# Altium project ultrazed_base.PrjPcb (part 1 of 2)
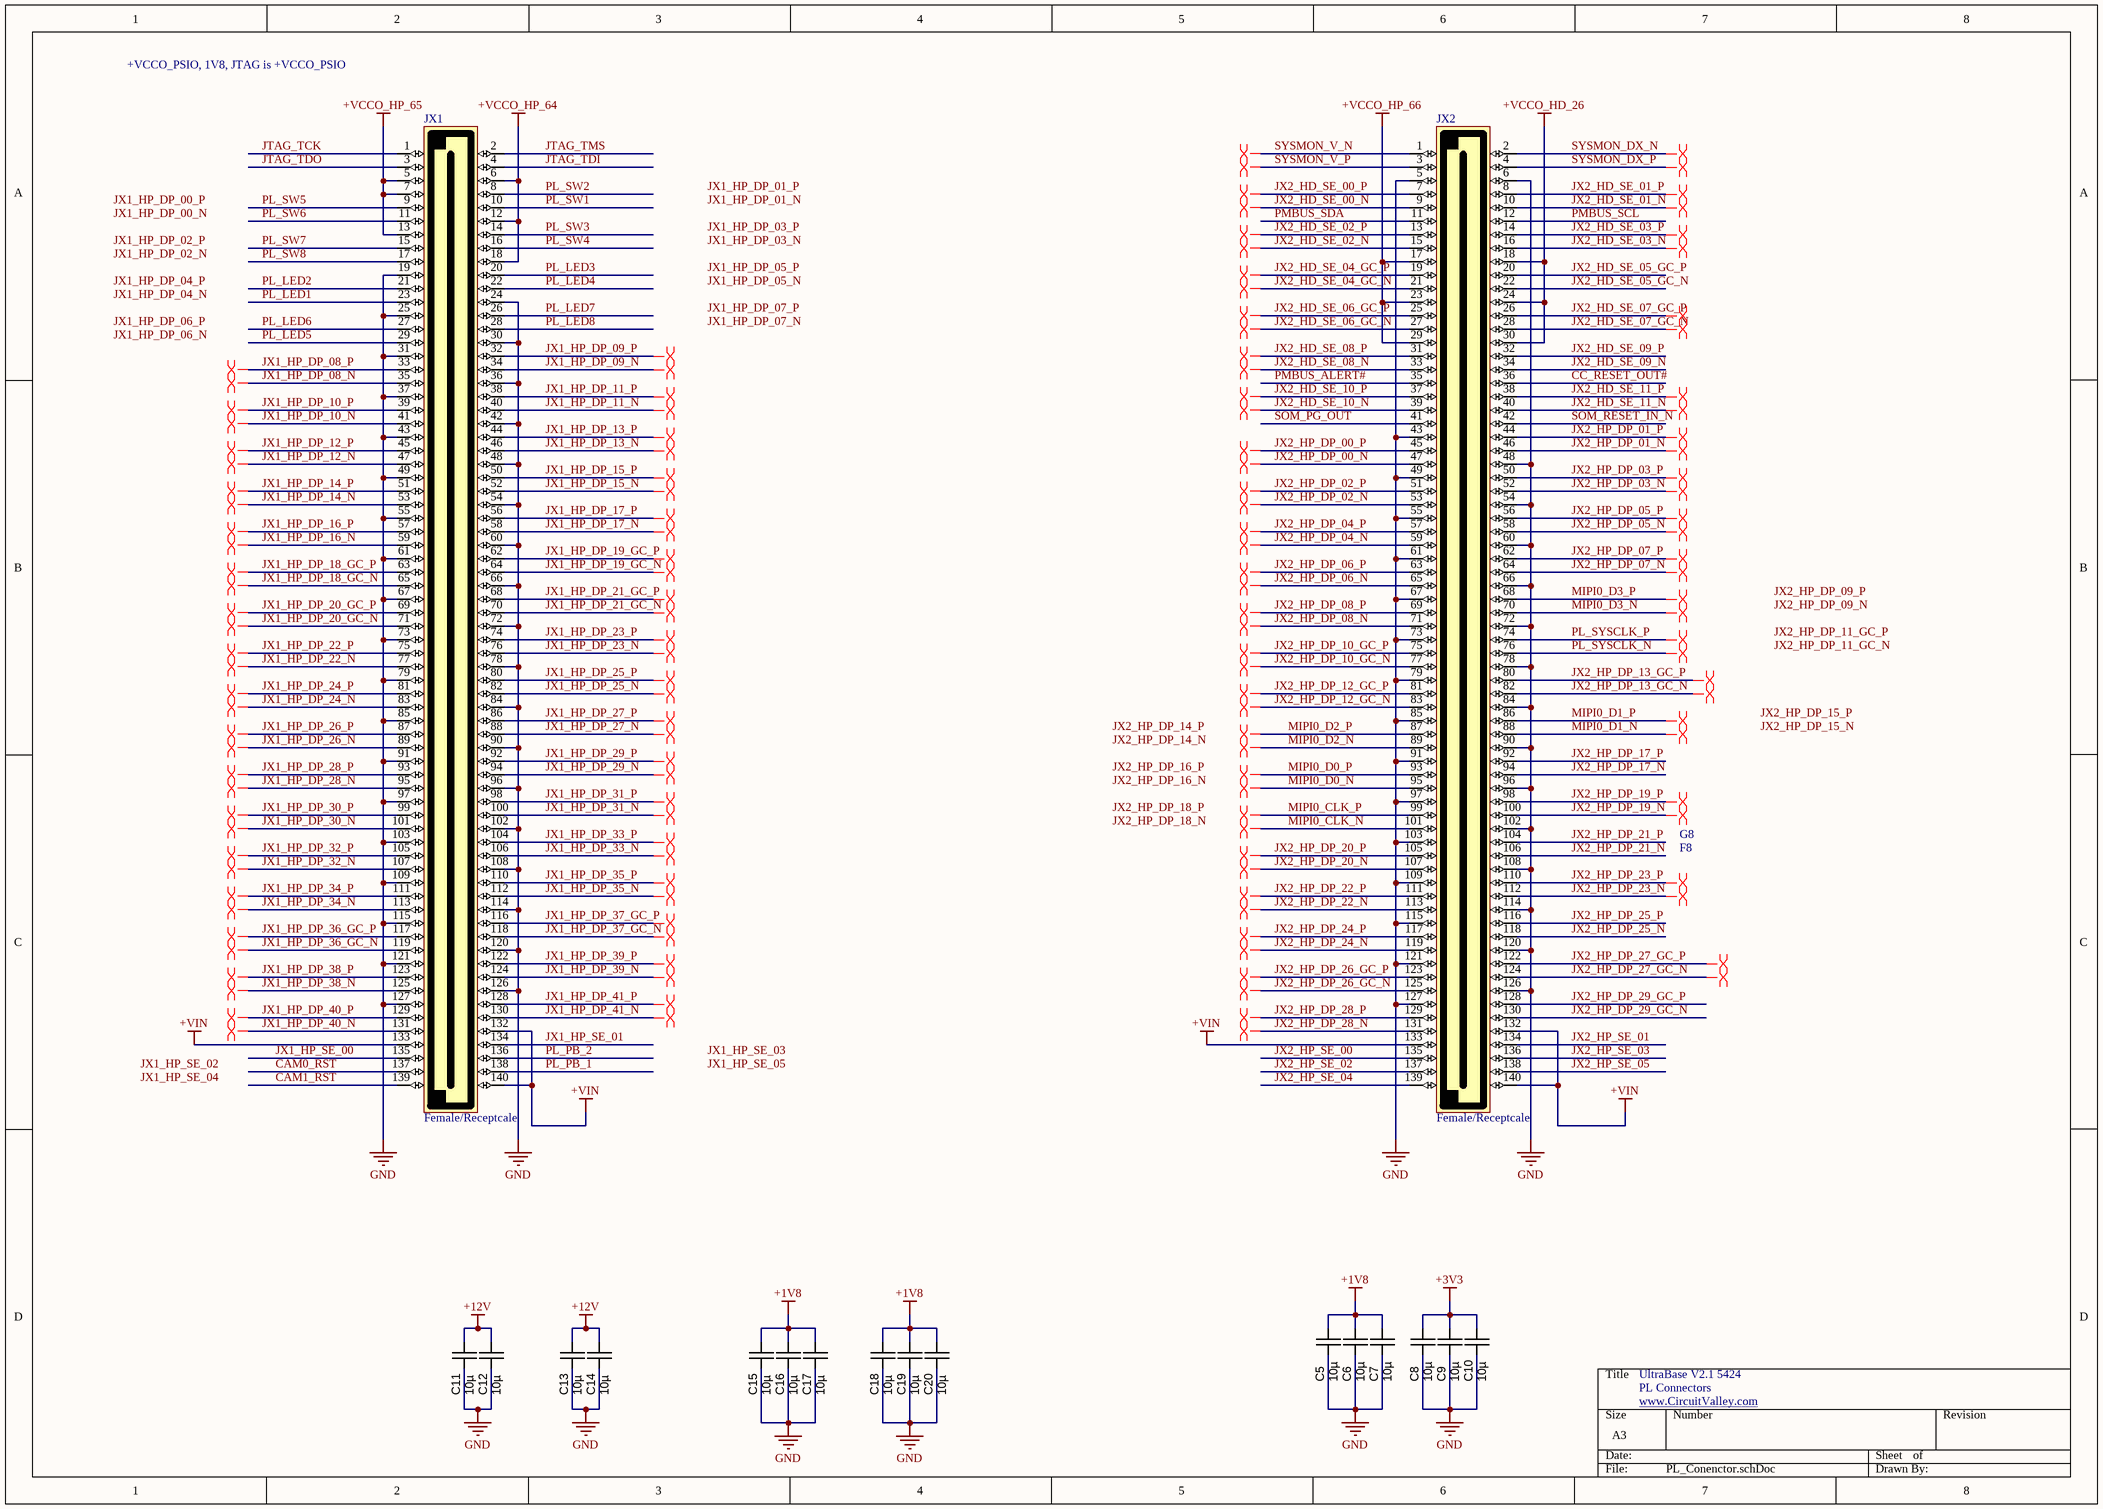
[diagram p0: PL_Conenctor.schDoc]
13 sheets, 354 parts. Net scope: global (net labels, ports and power ports of the same name join across sheets).
Board file: ultrazed_PCIe_x1.PcbDoc
Sheets:
  PL_Conenctor.schDoc
  PCIe.SchDoc
  SOM_JX_MIO.SchDoc
  MIO_SD.SchDoc
  POWER.SchDoc
  Ethernet.SchDoc
  DisplayPort.SchDoc
  Clock.SchDoc
  Switches_Leds.SchDoc
  PWR_INP.SchDoc
  IO.SchDoc
  JTAG.SchDoc
  MIPI.SchDoc

## Sheet PL_Conenctor.schDoc
size A3; SheetNumber: 1; SheetTotal: 13

### Parts
C5  10µ  [CAPC3225N]
C6  10µ  [CAPC3225N]
C7  10µ  [CAPC3225N]
C8  10µ  [CAPC3225N]
C9  10µ  [CAPC3225N]
C10  10µ  [CAPC3225N]
C11  10µ  [CAPC3225N]
C12  10µ  [CAPC3225N]
C13  10µ  [CAPC3225N]
C14  10µ  [CAPC3225N]
C15  10µ  [CAPC3225N]
C16  10µ  [CAPC3225N]
C17  10µ  [CAPC3225N]
C18  10µ  [CAPC3225N]
C19  10µ  [CAPC3225N]
C20  10µ  [CAPC3225N]
JX1  Female/Receptcale  [5177985-6]
JX2  Female/Receptcale  [5177985-6]

### Nets
+1V8: C5.1 C6.1 C7.1 C15.1 C16.1 C17.1 C18.1 C19.1 C20.1
+3V3: C8.1 C9.1 C10.1
+12V: C11.1 C12.1 C13.1 C14.1
+VCCO_HD_26: JX2.18 JX2.24 JX2.30
+VCCO_HP_64: JX1.6 JX1.12 JX1.18
+VCCO_HP_65: JX1.5 JX1.7 JX1.13
+VCCO_HP_66: JX2.17 JX2.23 JX2.29
+VIN: JX1.132 JX1.133 JX1.140 JX2.132 JX2.133 JX2.140
GND: C5.2 C6.2 C7.2 C8.2 C9.2 C10.2 C11.2 C12.2 C13.2 C14.2 C15.2 C16.2 C17.2 C18.2 C19.2 C20.2 JX1.19 JX1.24 JX1.25 JX1.30 JX1.31 JX1.36 JX1.37 JX1.42 JX1.43 JX1.48 JX1.49 JX1.54 JX1.55 JX1.60 JX1.61 JX1.66 JX1.67 JX1.72 JX1.73 JX1.78 JX1.79 JX1.84 JX1.85 JX1.90 JX1.91 JX1.96 JX1.97 JX1.102 JX1.103 JX1.108 JX1.109 JX1.114 JX1.115 JX1.120 JX1.121 JX1.126 JX1.127 JX2.5 JX2.6 JX2.43 JX2.48 JX2.49 JX2.54 JX2.55 JX2.60 JX2.61 JX2.66 JX2.67 JX2.72 JX2.73 JX2.78 JX2.79 JX2.84 JX2.85 JX2.90 JX2.91 JX2.96 JX2.97 JX2.102 JX2.103 JX2.108 JX2.109 JX2.114 JX2.115 JX2.120 JX2.121 JX2.126 JX2.127
CAM0_RST: JX1.137
CAM1_RST: JX1.139
CC_RESET_OUT#: JX2.36
JTAG_TCK: JX1.1
JTAG_TDI: JX1.4
JTAG_TDO: JX1.3
JTAG_TMS: JX1.2
JX1_HP_DP_08_N: JX1.35
JX1_HP_DP_08_P: JX1.33
JX1_HP_DP_09_N: JX1.34
JX1_HP_DP_09_P: JX1.32
JX1_HP_DP_10_N: JX1.41
JX1_HP_DP_10_P: JX1.39
JX1_HP_DP_11_N: JX1.40
JX1_HP_DP_11_P: JX1.38
JX1_HP_DP_12_N: JX1.47
JX1_HP_DP_12_P: JX1.45
JX1_HP_DP_13_N: JX1.46
JX1_HP_DP_13_P: JX1.44
JX1_HP_DP_14_N: JX1.53
JX1_HP_DP_14_P: JX1.51
JX1_HP_DP_15_N: JX1.52
JX1_HP_DP_15_P: JX1.50
JX1_HP_DP_16_N: JX1.59
JX1_HP_DP_16_P: JX1.57
JX1_HP_DP_17_N: JX1.58
JX1_HP_DP_17_P: JX1.56
JX1_HP_DP_18_GC_N: JX1.65
JX1_HP_DP_18_GC_P: JX1.63
JX1_HP_DP_19_GC_N: JX1.64
JX1_HP_DP_19_GC_P: JX1.62
JX1_HP_DP_20_GC_N: JX1.71
JX1_HP_DP_20_GC_P: JX1.69
JX1_HP_DP_21_GC_N: JX1.70
JX1_HP_DP_21_GC_P: JX1.68
JX1_HP_DP_22_N: JX1.77
JX1_HP_DP_22_P: JX1.75
JX1_HP_DP_23_N: JX1.76
JX1_HP_DP_23_P: JX1.74
JX1_HP_DP_24_N: JX1.83
JX1_HP_DP_24_P: JX1.81
JX1_HP_DP_25_N: JX1.82
JX1_HP_DP_25_P: JX1.80
JX1_HP_DP_26_N: JX1.89
JX1_HP_DP_26_P: JX1.87
JX1_HP_DP_27_N: JX1.88
JX1_HP_DP_27_P: JX1.86
JX1_HP_DP_28_N: JX1.95
JX1_HP_DP_28_P: JX1.93
JX1_HP_DP_29_N: JX1.94
JX1_HP_DP_29_P: JX1.92
JX1_HP_DP_30_N: JX1.101
JX1_HP_DP_30_P: JX1.99
JX1_HP_DP_31_N: JX1.100
JX1_HP_DP_31_P: JX1.98
JX1_HP_DP_32_N: JX1.107
JX1_HP_DP_32_P: JX1.105
JX1_HP_DP_33_N: JX1.106
JX1_HP_DP_33_P: JX1.104
JX1_HP_DP_34_N: JX1.113
JX1_HP_DP_34_P: JX1.111
JX1_HP_DP_35_N: JX1.112
JX1_HP_DP_35_P: JX1.110
JX1_HP_DP_36_GC_N: JX1.119
JX1_HP_DP_36_GC_P: JX1.117
JX1_HP_DP_37_GC_N: JX1.118
JX1_HP_DP_37_GC_P: JX1.116
JX1_HP_DP_38_N: JX1.125
JX1_HP_DP_38_P: JX1.123
JX1_HP_DP_39_N: JX1.124
JX1_HP_DP_39_P: JX1.122
JX1_HP_DP_40_N: JX1.131
JX1_HP_DP_40_P: JX1.129
JX1_HP_DP_41_N: JX1.130
JX1_HP_DP_41_P: JX1.128
JX1_HP_SE_00: JX1.135
JX1_HP_SE_01: JX1.134
JX2_HD_SE_00_N: JX2.9
JX2_HD_SE_00_P: JX2.7
JX2_HD_SE_01_N: JX2.10
JX2_HD_SE_01_P: JX2.8
JX2_HD_SE_02_N: JX2.15
JX2_HD_SE_02_P: JX2.13
JX2_HD_SE_03_N: JX2.16
JX2_HD_SE_03_P: JX2.14
JX2_HD_SE_04_GC_N: JX2.21
JX2_HD_SE_04_GC_P: JX2.19
JX2_HD_SE_05_GC_N: JX2.22
JX2_HD_SE_05_GC_P: JX2.20
JX2_HD_SE_06_GC_N: JX2.27
JX2_HD_SE_06_GC_P: JX2.25
JX2_HD_SE_07_GC_N: JX2.28
JX2_HD_SE_07_GC_P: JX2.26
JX2_HD_SE_08_N: JX2.33
JX2_HD_SE_08_P: JX2.31
JX2_HD_SE_09_N: JX2.34
JX2_HD_SE_09_P: JX2.32
JX2_HD_SE_10_N: JX2.39
JX2_HD_SE_10_P: JX2.37
JX2_HD_SE_11_N: JX2.40
JX2_HD_SE_11_P: JX2.38
JX2_HP_DP_00_N: JX2.47
JX2_HP_DP_00_P: JX2.45
JX2_HP_DP_01_N: JX2.46
JX2_HP_DP_01_P: JX2.44
JX2_HP_DP_02_N: JX2.53
JX2_HP_DP_02_P: JX2.51
JX2_HP_DP_03_N: JX2.52
JX2_HP_DP_03_P: JX2.50
JX2_HP_DP_04_N: JX2.59
JX2_HP_DP_04_P: JX2.57
JX2_HP_DP_05_N: JX2.58
JX2_HP_DP_05_P: JX2.56
JX2_HP_DP_06_N: JX2.65
JX2_HP_DP_06_P: JX2.63
JX2_HP_DP_07_N: JX2.64
JX2_HP_DP_07_P: JX2.62
JX2_HP_DP_08_N: JX2.71
JX2_HP_DP_08_P: JX2.69
JX2_HP_DP_10_GC_N: JX2.77
JX2_HP_DP_10_GC_P: JX2.75
JX2_HP_DP_12_GC_N: JX2.83
JX2_HP_DP_12_GC_P: JX2.81
JX2_HP_DP_13_GC_N: JX2.82
JX2_HP_DP_13_GC_P: JX2.80
JX2_HP_DP_17_N: JX2.94
JX2_HP_DP_17_P: JX2.92
JX2_HP_DP_19_N: JX2.100
JX2_HP_DP_19_P: JX2.98
JX2_HP_DP_20_N: JX2.107
JX2_HP_DP_20_P: JX2.105
JX2_HP_DP_21_N: JX2.106
JX2_HP_DP_21_P: JX2.104
JX2_HP_DP_22_N: JX2.113
JX2_HP_DP_22_P: JX2.111
JX2_HP_DP_23_N: JX2.112
JX2_HP_DP_23_P: JX2.110
JX2_HP_DP_24_N: JX2.119
JX2_HP_DP_24_P: JX2.117
JX2_HP_DP_25_N: JX2.118
JX2_HP_DP_25_P: JX2.116
JX2_HP_DP_26_GC_N: JX2.125
JX2_HP_DP_26_GC_P: JX2.123
JX2_HP_DP_27_GC_N: JX2.124
JX2_HP_DP_27_GC_P: JX2.122
JX2_HP_DP_28_N: JX2.131
JX2_HP_DP_28_P: JX2.129
JX2_HP_DP_29_GC_N: JX2.130
JX2_HP_DP_29_GC_P: JX2.128
JX2_HP_SE_00: JX2.135
JX2_HP_SE_01: JX2.134
JX2_HP_SE_02: JX2.137
JX2_HP_SE_03: JX2.136
JX2_HP_SE_04: JX2.139
JX2_HP_SE_05: JX2.138
MIPI0_CLK_N: JX2.101
MIPI0_CLK_P: JX2.99
MIPI0_D0_N: JX2.95
MIPI0_D0_P: JX2.93
MIPI0_D1_N: JX2.88
MIPI0_D1_P: JX2.86
MIPI0_D2_N: JX2.89
MIPI0_D2_P: JX2.87
MIPI0_D3_N: JX2.70
MIPI0_D3_P: JX2.68
PL_LED1: JX1.23
PL_LED2: JX1.21
PL_LED3: JX1.20
PL_LED4: JX1.22
PL_LED5: JX1.29
PL_LED6: JX1.27
PL_LED7: JX1.26
PL_LED8: JX1.28
PL_PB_1: JX1.138
PL_PB_2: JX1.136
PL_SW1: JX1.10
PL_SW2: JX1.8
PL_SW3: JX1.14
PL_SW4: JX1.16
PL_SW5: JX1.9
PL_SW6: JX1.11
PL_SW7: JX1.15
PL_SW8: JX1.17
PL_SYSCLK_N: JX2.76
PL_SYSCLK_P: JX2.74
PMBUS_ALERT#: JX2.35
PMBUS_SCL: JX2.12
PMBUS_SDA: JX2.11
SOM_PG_OUT: JX2.41
SOM_RESET_IN_N: JX2.42
SYSMON_DX_N: JX2.2
SYSMON_DX_P: JX2.4
SYSMON_V_N: JX2.1
SYSMON_V_P: JX2.3

### Layout directives
differential pair: JX1_HP_DP_08_N, JX1_HP_DP_08_P, JX1_HP_DP_09_N, JX1_HP_DP_09_P, JX1_HP_DP_10_N, JX1_HP_DP_10_P, JX1_HP_DP_11_N, JX1_HP_DP_11_P, JX1_HP_DP_12_N, JX1_HP_DP_12_P, JX1_HP_DP_13_N, JX1_HP_DP_13_P, JX1_HP_DP_14_N, JX1_HP_DP_14_P, JX1_HP_DP_15_N, JX1_HP_DP_15_P, JX1_HP_DP_16_N, JX1_HP_DP_16_P, JX1_HP_DP_17_N, JX1_HP_DP_17_P, JX1_HP_DP_18_GC_N, JX1_HP_DP_18_GC_P, JX1_HP_DP_19_GC_N, JX1_HP_DP_19_GC_P, JX1_HP_DP_20_GC_N, JX1_HP_DP_20_GC_P, JX1_HP_DP_21_GC_N, JX1_HP_DP_21_GC_P, JX1_HP_DP_22_N, JX1_HP_DP_22_P, JX1_HP_DP_23_N, JX1_HP_DP_23_P, JX1_HP_DP_24_N, JX1_HP_DP_24_P, JX1_HP_DP_25_N, JX1_HP_DP_25_P, JX1_HP_DP_26_N, JX1_HP_DP_26_P, JX1_HP_DP_27_N, JX1_HP_DP_27_P, JX1_HP_DP_28_N, JX1_HP_DP_28_P, JX1_HP_DP_29_N, JX1_HP_DP_29_P, JX1_HP_DP_30_N, JX1_HP_DP_30_P, JX1_HP_DP_31_N, JX1_HP_DP_31_P, JX1_HP_DP_32_N, JX1_HP_DP_32_P, JX1_HP_DP_33_N, JX1_HP_DP_33_P, JX1_HP_DP_34_N, JX1_HP_DP_34_P, JX1_HP_DP_35_N, JX1_HP_DP_35_P, JX1_HP_DP_36_GC_N, JX1_HP_DP_36_GC_P, JX1_HP_DP_37_GC_N, JX1_HP_DP_37_GC_P, JX1_HP_DP_38_N, JX1_HP_DP_38_P, JX1_HP_DP_39_N, JX1_HP_DP_39_P, JX1_HP_DP_40_N, JX1_HP_DP_40_P, JX1_HP_DP_41_N, JX1_HP_DP_41_P, JX2_HD_SE_00_N, JX2_HD_SE_00_P, JX2_HD_SE_01_N, JX2_HD_SE_01_P, JX2_HD_SE_02_N, JX2_HD_SE_02_P, JX2_HD_SE_03_N, JX2_HD_SE_03_P, JX2_HD_SE_04_GC_N, JX2_HD_SE_04_GC_P, JX2_HD_SE_06_GC_N, JX2_HD_SE_06_GC_P, JX2_HD_SE_07_GC_N, JX2_HD_SE_07_GC_P, JX2_HD_SE_08_N, JX2_HD_SE_08_P, JX2_HD_SE_10_N, JX2_HD_SE_10_P, JX2_HD_SE_11_N, JX2_HD_SE_11_P, JX2_HP_DP_00_N, JX2_HP_DP_00_P, JX2_HP_DP_01_N, JX2_HP_DP_01_P, JX2_HP_DP_02_N, JX2_HP_DP_02_P, JX2_HP_DP_03_N, JX2_HP_DP_03_P, JX2_HP_DP_04_N, JX2_HP_DP_04_P, JX2_HP_DP_05_N, JX2_HP_DP_05_P, JX2_HP_DP_06_N, JX2_HP_DP_06_P, JX2_HP_DP_07_N, JX2_HP_DP_07_P, JX2_HP_DP_08_N, JX2_HP_DP_08_P, JX2_HP_DP_10_GC_N, JX2_HP_DP_10_GC_P, JX2_HP_DP_12_GC_N, JX2_HP_DP_12_GC_P, JX2_HP_DP_13_GC_N, JX2_HP_DP_13_GC_P, JX2_HP_DP_19_N, JX2_HP_DP_19_P, JX2_HP_DP_20_N, JX2_HP_DP_20_P, JX2_HP_DP_22_N, JX2_HP_DP_22_P, JX2_HP_DP_23_N, JX2_HP_DP_23_P, JX2_HP_DP_24_N, JX2_HP_DP_24_P, JX2_HP_DP_26_GC_N, JX2_HP_DP_26_GC_P, JX2_HP_DP_27_GC_N, JX2_HP_DP_27_GC_P, JX2_HP_DP_28_N, JX2_HP_DP_28_P, MIPI0_CLK_N, MIPI0_CLK_P, MIPI0_D0_N, MIPI0_D0_P, MIPI0_D1_N, MIPI0_D1_P, MIPI0_D2_N, MIPI0_D2_P, MIPI0_D3_N, MIPI0_D3_P, PL_SYSCLK_N, PL_SYSCLK_P, SYSMON_DX_N, SYSMON_DX_P, SYSMON_V_N, SYSMON_V_P

### Notes on the sheet
- +VCCO_PSIO, 1V8, JTAG is +VCCO_PSIO
- G8
- F8
- UltraBase V2.1 5424
- PL Connectors
- www.CircuitValley.com <http://www.CircuitValley.com>
- Labels drawn without touching a wire or pin: JX1_HP_DP_00_N, JX1_HP_DP_00_P, JX1_HP_DP_01_N, JX1_HP_DP_01_P, JX1_HP_DP_02_N, JX1_HP_DP_02_P, JX1_HP_DP_03_N, JX1_HP_DP_03_P, JX1_HP_DP_04_N, JX1_HP_DP_04_P, JX1_HP_DP_05_N, JX1_HP_DP_05_P, JX1_HP_DP_06_N, JX1_HP_DP_06_P, JX1_HP_DP_07_N, JX1_HP_DP_07_P, JX1_HP_SE_02, JX1_HP_SE_03, JX1_HP_SE_04, JX1_HP_SE_05, JX2_HP_DP_09_N, JX2_HP_DP_09_P, JX2_HP_DP_11_GC_N, JX2_HP_DP_11_GC_P, JX2_HP_DP_14_N, JX2_HP_DP_14_P, JX2_HP_DP_15_N, JX2_HP_DP_15_P, JX2_HP_DP_16_N, JX2_HP_DP_16_P, JX2_HP_DP_18_N, JX2_HP_DP_18_P

### Library data of the parts
C5-C20 = CAPC_10u_1210_50V: Capacitor SMD Cer 10uF 20% 16V X5R 1210; Manufacturer 1: Taiyo Yuden; Manufacturer Part Number 1: UMK325BJ106MM-T; Ratings: 50V; X5R; Material: ceramic; Package / Case: 1210 (3225 Metric); Tolerance: ±20%; Size / Dimension: 0.126" L x 0.098" W (3.20mm x 2.50mm); Supplier 1: Digi-Key; Supplier Part Number 1: 587-2225-1-ND; Value: 10µ
JX1 = 5177985-6_Ultrazed_JX1: 140 Pin Ultrascale  SOM Connector with ultrazed specific SOM net delay
JX2 = 5177985-6_Ultrazed_JX2: 140 Pin Ultrascale  SOM Connector with ultrazed specific SOM net delay

## Sheet PCIe.SchDoc
size A3; SheetNumber: 2; SheetTotal: 13
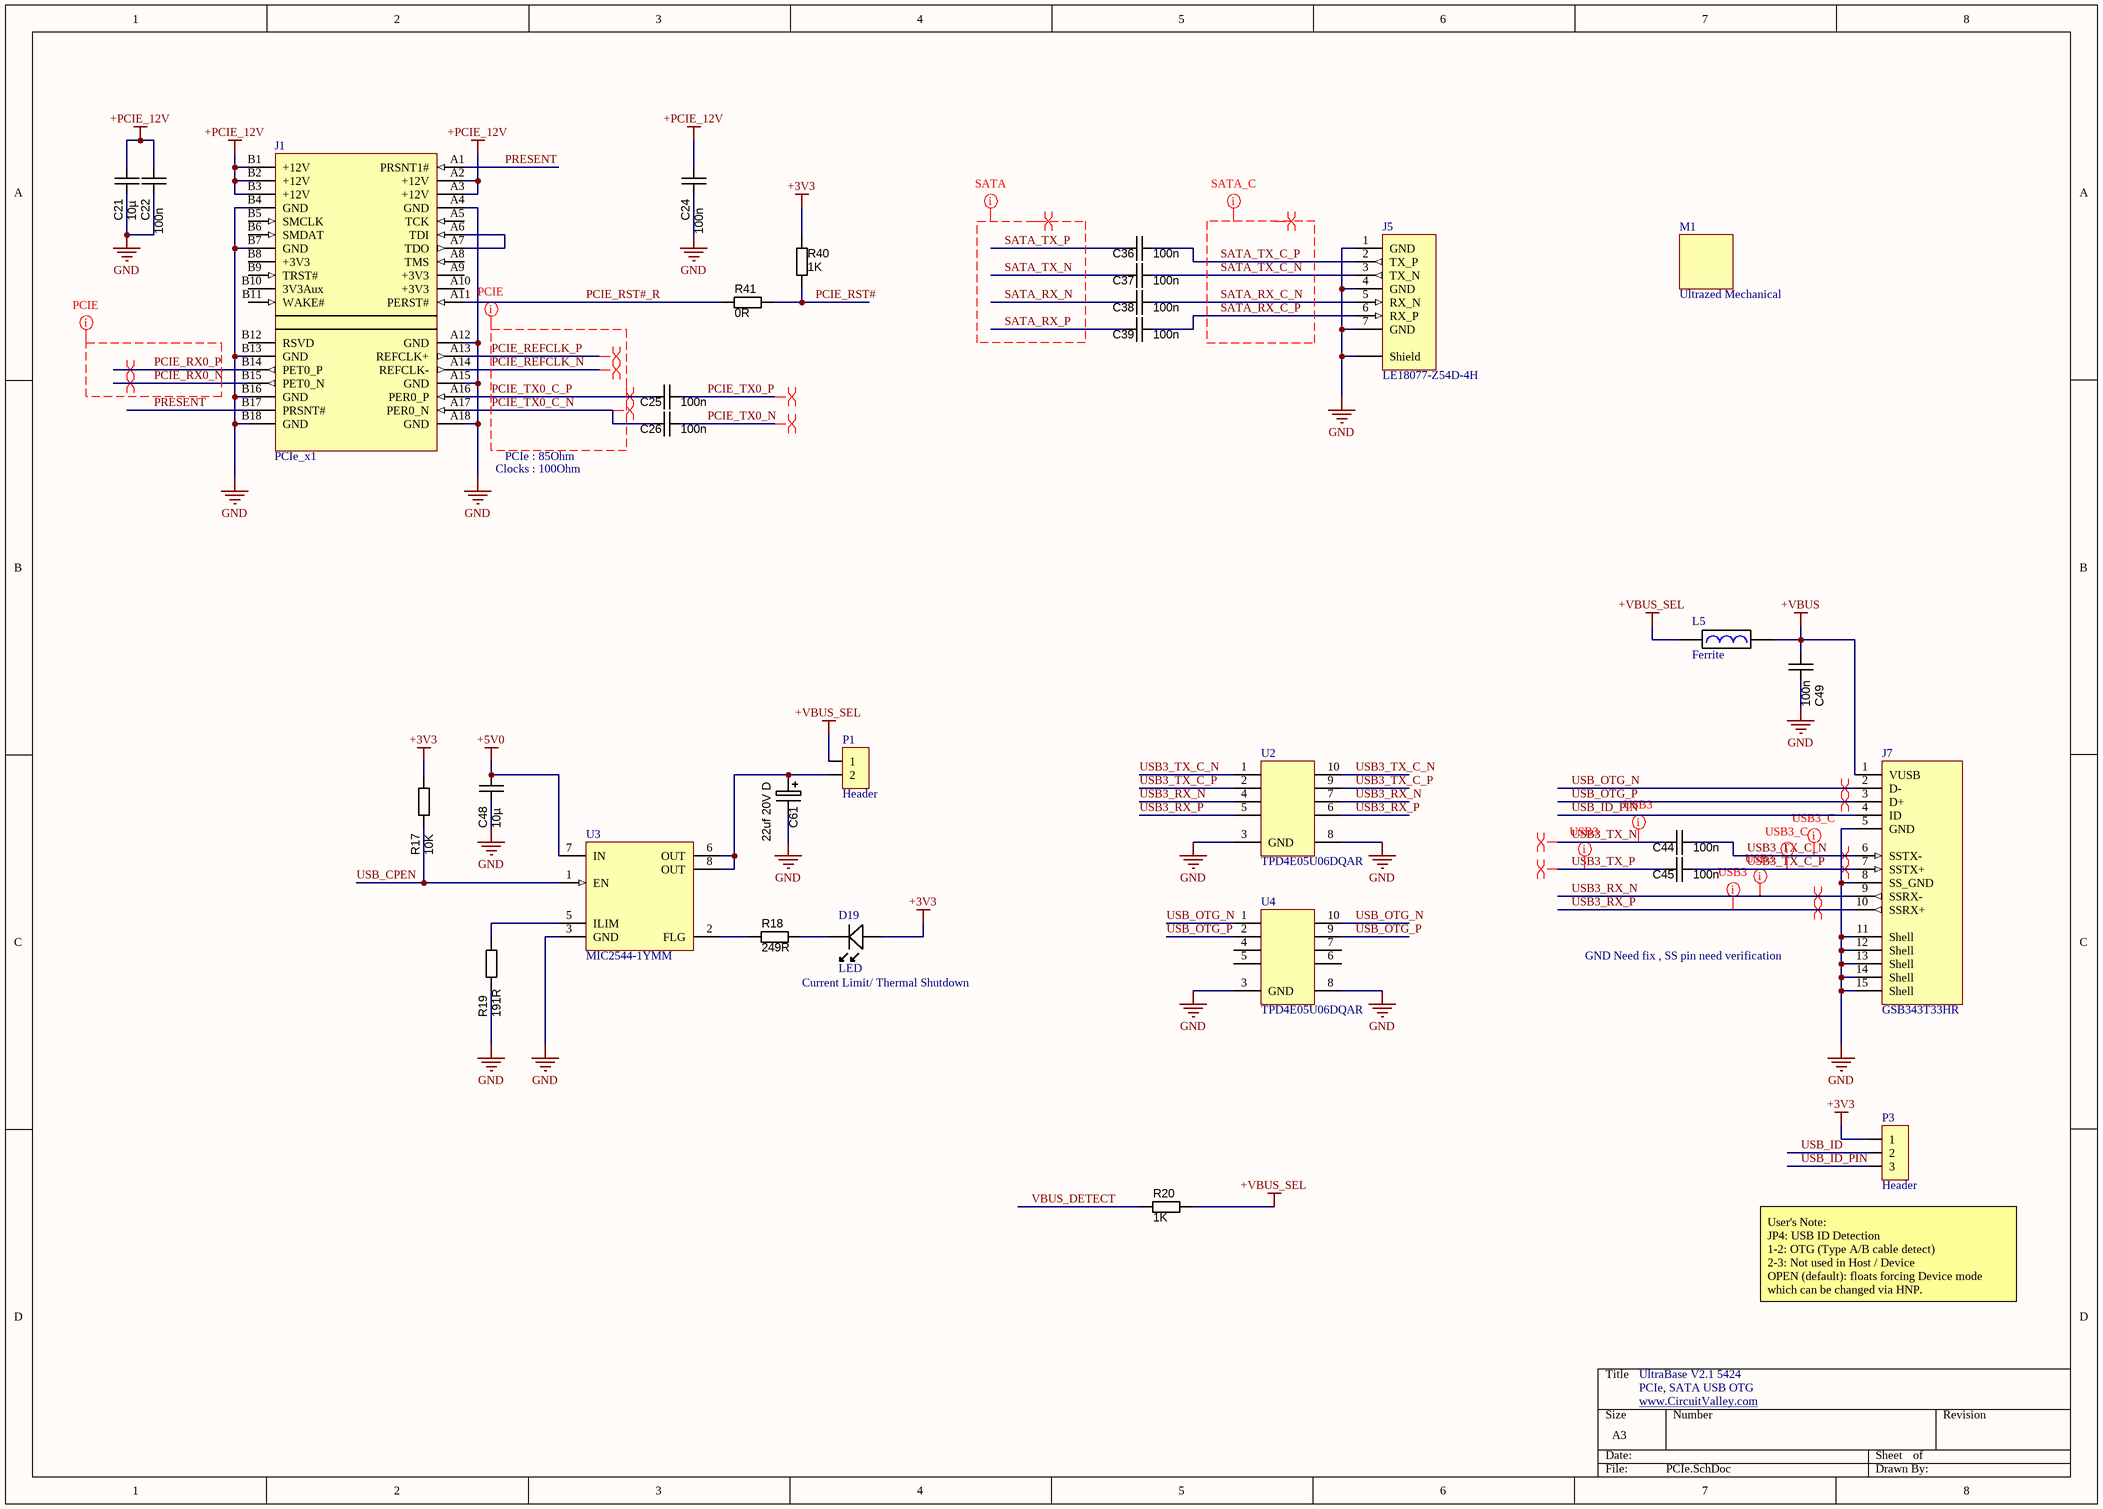
[diagram p1: PCIe.SchDoc]

### Parts
C21  10µ  [CAPC3225N]
C22  100n  [CAPC1608N]
C24  100n  [CAPC1608N]
C25  100n  [CAPC1005N]
C26  100n  [CAPC1005N]
C36  100n  [CAPC1005N]
C37  100n  [CAPC1005N]
C38  100n  [CAPC1005N]
C39  100n  [CAPC1005N]
C44  100n  [CAPC1005N]
C45  100n  [CAPC1005N]
C48  10µ  [CAPC3225N]
C49  100n  [CAPC1608N]
C61  value 22uf 20V D  [CAPMP7343X310N]  (hidden comment: 47uf 20V D)
D19  LED  [1206_LED]
J1  PCIe_x1  [PCIe_x1]
J5  LE18077-Z54D-4H  [LE18077-Z54D-4H]
J7  GSB343T33HR  [GSB343T33HR]
L5  Ferrite  [FBC2012N]
M1  Ultrazed Mechanical  [ULTRAZED_SOM_Mechanical]
P1  Header  [Header2x]
P3  Header  [Header3x]
R17  value 10K  [RESC1608N]  (hidden comment: RES_NL_0603)
R18  value 249R  [RESC1608N]  (hidden comment: RES_NL_0603)
R19  value 191R  [RESC1608N]  (hidden comment: RES_NL_0603)
R20  value 1K  [RESC1608N]  (hidden comment: RES_NL_0603)
R40  value 1K  [RESC1608N]  (hidden comment: RES_NL_0603)
R41  value 0R  [RESC1608N]  (hidden comment: RES_NL_0603)
U2  TPD4E05U06DQAR  [uDFN-10]
U3  MIC2544-1YMM  [MSOP8]
U4  TPD4E05U06DQAR  [uDFN-10]

### Nets
+3V3: D19.A P3.1 R17.1 R40.2
+5V0: C48.1 U3.7(IN)
+PCIE_12V: C21.1 C22.1 C24.1 J1.A2(+12V) J1.A3(+12V) J1.B1(+12V) J1.B2(+12V) J1.B3(+12V)
+VBUS: C49.1 J7.1(VUSB) L5.2
+VBUS_SEL: L5.1 P1.1 R20.2
GND: C21.2 C22.2 C24.2 C48.2 C49.2 C61.2 J1.A4(GND) J1.A12(GND) J1.A15(GND) J1.A18(GND) J1.B4(GND) J1.B7(GND) J1.B13(GND) J1.B16(GND) J1.B18(GND) J5.1(GND) J5.4(GND) J5.7(GND) J5.SH(Shield) J7.5(GND) J7.8(SS_GND) J7.11(Shell) J7.12(Shell) J7.13(Shell) J7.14(Shell) J7.15(Shell) R19.2 U2.3(GND) U2.8(GND) U3.3(GND) U4.3(GND) U4.8(GND)
PCIE_REFCLK_N: J1.A14(REFCLK-)
PCIE_REFCLK_P: J1.A13(REFCLK+)
PCIE_RST#: R40.1 R41.2
PCIE_RST#_R: J1.A11(PERST#) R41.1
PCIE_RX0_N: J1.B15(PET0_N)
PCIE_RX0_P: J1.B14(PET0_P)
PCIE_TX0_C_N: C26.1 J1.A17(PER0_N)
PCIE_TX0_C_P: C25.1 J1.A16(PER0_P)
PCIE_TX0_N: C26.2
PCIE_TX0_P: C25.2
PRESENT: J1.A1(PRSNT1#) J1.B17(PRSNT#)
SATA_RX_C_N: C38.2 J5.5(RX_N)
SATA_RX_C_P: C39.2 J5.6(RX_P)
SATA_RX_N: C38.1
SATA_RX_P: C39.1
SATA_TX_C_N: C37.2 J5.3(TX_N)
SATA_TX_C_P: C36.2 J5.2(TX_P)
SATA_TX_N: C37.1
SATA_TX_P: C36.1
USB3_RX_N: J7.9(SSRX-) U2.4 U2.7
USB3_RX_P: J7.10(SSRX+) U2.5 U2.6
USB3_TX_C_N: C44.2 J7.6(SSTX-) U2.1 U2.10
USB3_TX_C_P: C45.2 J7.7(SSTX+) U2.2 U2.9
USB3_TX_N: C44.1
USB3_TX_P: C45.1
USB_CPEN: R17.2 U3.1(EN)
USB_ID: P3.2
USB_ID_PIN: J7.4(ID) P3.3
USB_OTG_N: J7.2(D-) U4.1 U4.10
USB_OTG_P: J7.3(D+) U4.2 U4.9
VBUS_DETECT: R20.1
NetC61_1: C61.1 P1.2 U3.6(OUT) U3.8(OUT)
NetD19_K: D19.K R18.2
NetJ1_A6: J1.A6(TDI) J1.A7(TDO)
NetR18_1: R18.1 U3.2(FLG)
NetR19_1: R19.1 U3.5(ILIM)

Not connected (* = marked no-connect by the designer): J1 A5(TCK) A8(TMS) A9(+3V3) A10(+3V3) B5(SMCLK) B6(SMDAT) B8(+3V3) B9(TRST#) B10(3V3Aux) B11(WAKE#) B12(RSVD); U4 4 5 6 7

### Layout directives
differential pair: PCIE_REFCLK_N, PCIE_REFCLK_P, PCIE_RX0_N, PCIE_RX0_P, PCIE_TX0_C_N, PCIE_TX0_C_P, PCIE_TX0_N, PCIE_TX0_P, SATA_RX_C_N, SATA_RX_C_P, SATA_RX_N, SATA_RX_P, SATA_TX_C_N, SATA_TX_C_P, SATA_TX_N, SATA_TX_P, USB3_RX_N, USB3_RX_P, USB3_TX_C_N, USB3_TX_C_P, USB3_TX_N, USB3_TX_P, USB_OTG_N, USB_OTG_P
net class SATA: SATA_RX_N, SATA_RX_P, SATA_TX_N, SATA_TX_P
net class SATA_C: SATA_RX_C_N, SATA_RX_C_P, SATA_TX_C_N, SATA_TX_C_P
net class PCIE: PCIE_REFCLK_N, PCIE_REFCLK_P, PCIE_RX0_N, PCIE_RX0_P, PCIE_TX0_C_N, PCIE_TX0_C_P
net class USB3: USB3_RX_N, USB3_RX_P, USB3_TX_N, USB3_TX_P
net class USB3_C: USB3_TX_C_N, USB3_TX_C_P

### Notes on the sheet
- Clocks : 100Ohm
- PCIe : 85Ohm
- Current Limit/ Thermal Shutdown
- GND Need fix , SS pin need verification
- (near P3) User's Note:
  JP4: USB ID Detection
  1-2: OTG (Type A/B cable detect)
  2-3: Not used in Host / Device
  OPEN (default): floats forcing Device mode
  which can be changed via HNP.
- PCIe, SATA USB OTG
- UltraBase V2.1 5424
- www.CircuitValley.com <http://www.CircuitValley.com>

### Library data of the parts
C21 C48 = CAPC_10u_1210_50V: as C5 on sheet PL_Conenctor; Package / Case: 1210 (3225 Metric); Tolerance: ±20%; Size / Dimension: 0.126" L x 0.098" W (3.20mm x 2.50mm); Supplier 1: Digi-Key; Supplier Part Number 1: 587-2225-1-ND; Value: 10µ
C22 C24 C49 = CAPC_120p_0603_C0G_50V: Capacitor SMD Cer 120pF 10% 50V C0G 0603; Manufacturer 1: Kemet; Manufacturer Part Number 1: C0603C121K5GACTU; Ratings: 50V; C0G; Tolerance: ±10%; Operating Temperature: -55°C ~ 125°C; Package / Case: 0603 (1608 Metric); Supplier 1: Mouser; Supplier Part Number 1: 80-C0603C121K5G; Value: 100n
C25 C26 C36-C39 C44 C45 = CAPC_100n_0402_16V_10%: Capacitor SMD Cer 100nF 10% 16V X5R 0402; Manufacturer 1: AVX Corporation; Manufacturer Part Number 1: 0402YD104KAT2A; Ratings: 16V; X7R; Tolerance: ±10%; Operating Temperature: -55°C ~ 125°C; Package / Case: 0402 (1005 Metric); Size / Dimension: 0.039" L x 0.020" W (1.00mm x 0.50mm); Supplier 1: Digi-Key; Supplier Part Number 1: 478-1126-1-ND; ComponentLink1URL: http://www.avx.com/docs/Catalogs/cx5r.pdf; ComponentLink1Description: http://www.avx.com/docs/Catalogs/cx5r.pdf; Supplier 2: Digi-Key; Supplier Part Number 2: 311-1347-1-ND; Manufacturer 2: Yageo; Manufacturer Part Number 2: CC0402KRX5R7BB104; ComponentLink2URL: http://www.yageo.com/documents/recent/UPY-GPHC_X5R_4V-to-50V_12.pdf; ComponentLink2Description: http://www.yageo.com/documents/recent/UPY-GPHC_X5R_4V-to-50V_12.pdf; Value: 100n
C61 = CAPT_330u_2917_6V3: Capacitor SMD Tant 330uF 20% 6V3 2917; Manufacturer Part Number: T520D337M006ATE015; Part: TCJY226M025R0070; Ratings: 6.3V; Material: Solid Tantalum; ESR (Equivalent Series Resistance): 15 mOhm; Package / Case: 2917 (7343 Metric); Tolerance: ±20%; Operating Temperature: -55°C ~ 125°C; Size / Dimension: 0.287" L x 0.169" W (7.30mm x 4.30mm); Height - Seated (Max): 0.122" (3.10mm); Manufacturer Size Code: D; Supplier 1: Digi-Key; Supplier Part Number 1: 399-4052-1-ND; ComponentLink1URL: http://www.kemet.com/datasheets&T520D337M006ATE015; ComponentLink1Description: T520D Datasheet
J1 = PCIe_x1: PCIe X1 Card edge
J5 = SATA: Sata Connector Vertical
J7 = GSB343T33HR: USB3.2 Micro B
L5 = Ferrite Bead
M1 = UltrazedSOMMechanical
P1 = Header_2Pin: 2 Pin Header
P3 = Header_3Pin: 3 Pin Header
R17-R20 R40 R41 = RES_NL_0603: Resistor, SMD chip; Manufacturer 1: Royal Ohm; Ratings: 1/10 W; Tolerance: ±5%; Package / Case: 0603 (1608 metric)
U2 U4 = TPD4E05U06DQAR: ESD Protection
U3 = MIC2544: High Side Switch, Current limit programmable

## Sheet SOM_JX_MIO.SchDoc
size A3; SheetNumber: 3; SheetTotal: 13
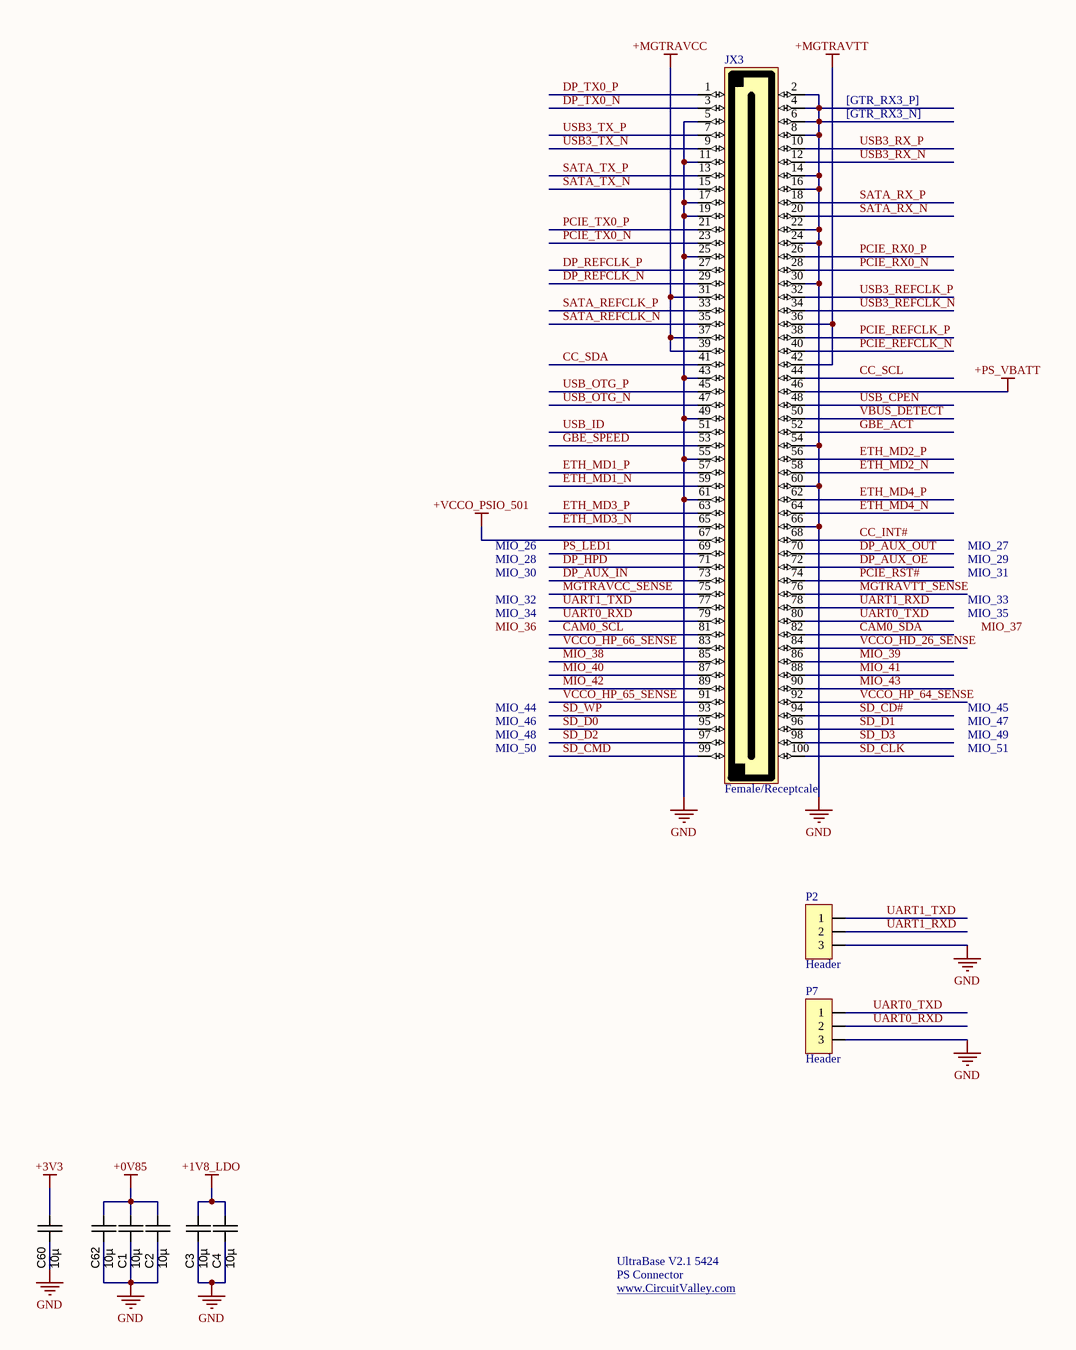
[diagram p2: SOM_JX_MIO.SchDoc]

### Parts
C1  10µ  [CAPC3225N]
C2  10µ  [CAPC3225N]
C3  10µ  [CAPC3225N]
C4  10µ  [CAPC3225N]
C60  10µ  [CAPC3225N]
C62  10µ  [CAPC3225N]
JX3  Female/Receptcale  [5177985-4]
P2  Header  [Header3x]
P7  Header  [Header3x]

### Nets
+0V85: C1.1 C2.1 C62.1
+1V8_LDO: C3.1 C4.1
+3V3: C60.1
+MGTRAVCC: JX3.31 JX3.37 JX3.39
+MGTRAVTT: JX3.36 JX3.42
+PS_VBATT: JX3.46
+VCCO_PSIO_501: JX3.67
GND: C1.2 C2.2 C3.2 C4.2 C60.2 C62.2 JX3.2 JX3.4 JX3.5 JX3.6 JX3.8 JX3.11 JX3.14 JX3.16 JX3.17 JX3.19 JX3.22 JX3.24 JX3.25 JX3.30 JX3.43 JX3.49 JX3.54 JX3.55 JX3.60 JX3.61 JX3.66 P2.3 P7.3
CAM0_SCL: JX3.81
CAM0_SDA: JX3.82
CC_INT#: JX3.68
CC_SCL: JX3.44
CC_SDA: JX3.41
DP_AUX_IN: JX3.73
DP_AUX_OE: JX3.72
DP_AUX_OUT: JX3.70
DP_HPD: JX3.71
DP_REFCLK_N: JX3.29
DP_REFCLK_P: JX3.27
DP_TX0_N: JX3.3
DP_TX0_P: JX3.1
ETH_MD1_N: JX3.59
ETH_MD1_P: JX3.57
ETH_MD2_N: JX3.58
ETH_MD2_P: JX3.56
ETH_MD3_N: JX3.65
ETH_MD3_P: JX3.63
ETH_MD4_N: JX3.64
ETH_MD4_P: JX3.62
GBE_ACT: JX3.52
GBE_SPEED: JX3.53
MGTRAVCC_SENSE: JX3.75
MGTRAVTT_SENSE: JX3.76
MIO_38: JX3.85
MIO_39: JX3.86
MIO_40: JX3.87
MIO_41: JX3.88
MIO_42: JX3.89
MIO_43: JX3.90
PCIE_REFCLK_N: JX3.40
PCIE_REFCLK_P: JX3.38
PCIE_RST#: JX3.74
PCIE_RX0_N: JX3.28
PCIE_RX0_P: JX3.26
PCIE_TX0_N: JX3.23
PCIE_TX0_P: JX3.21
PS_LED1: JX3.69
SATA_REFCLK_N: JX3.35
SATA_REFCLK_P: JX3.33
SATA_RX_N: JX3.20
SATA_RX_P: JX3.18
SATA_TX_N: JX3.15
SATA_TX_P: JX3.13
SD_CD#: JX3.94
SD_CLK: JX3.100
SD_CMD: JX3.99
SD_D0: JX3.95
SD_D1: JX3.96
SD_D2: JX3.97
SD_D3: JX3.98
SD_WP: JX3.93
UART0_RXD: JX3.79 P7.2
UART0_TXD: JX3.80 P7.1
UART1_RXD: JX3.78 P2.2
UART1_TXD: JX3.77 P2.1
USB3_REFCLK_N: JX3.34
USB3_REFCLK_P: JX3.32
USB3_RX_N: JX3.12
USB3_RX_P: JX3.10
USB3_TX_N: JX3.9
USB3_TX_P: JX3.7
USB_CPEN: JX3.48
USB_ID: JX3.51
USB_OTG_N: JX3.47
USB_OTG_P: JX3.45
VBUS_DETECT: JX3.50
VCCO_HD_26_SENSE: JX3.84
VCCO_HP_64_SENSE: JX3.92
VCCO_HP_65_SENSE: JX3.91
VCCO_HP_66_SENSE: JX3.83

### Notes on the sheet
- [GTR_RX3_P]
- [GTR_RX3_N]
- MIO_32
- MIO_26
- MIO_28
- MIO_30
- MIO_33
- MIO_31
- MIO_29
- MIO_27
- MIO_34
- MIO_35
- MIO_48
- MIO_46
- MIO_44
- MIO_45
- MIO_47
- MIO_49
- MIO_50
- MIO_51
- UltraBase V2.1 5424
- PS Connector
- www.CircuitValley.com <http://www.CircuitValley.com>
- Labels drawn without touching a wire or pin: MIO_36, MIO_37

### Library data of the parts
C1-C4 C60 C62 = CAPC_10u_1210_50V: as C5 on sheet PL_Conenctor; Package / Case: 1210 (3225 Metric); Tolerance: ±20%; Size / Dimension: 0.126" L x 0.098" W (3.20mm x 2.50mm); Supplier 1: Digi-Key; Supplier Part Number 1: 587-2225-1-ND; Value: 10µ
JX3 = 5177985-4_Ultrazed: 100 Pin Ultrascale  SOM Connector with ultrazed specific SOM net delay
P2 = Header_3Pin: 3 Pin Header; Value: NC
P7 = Header_3Pin: 3 Pin Header

## Sheet MIO_SD.SchDoc
size A3; SheetNumber: 4; SheetTotal: 13
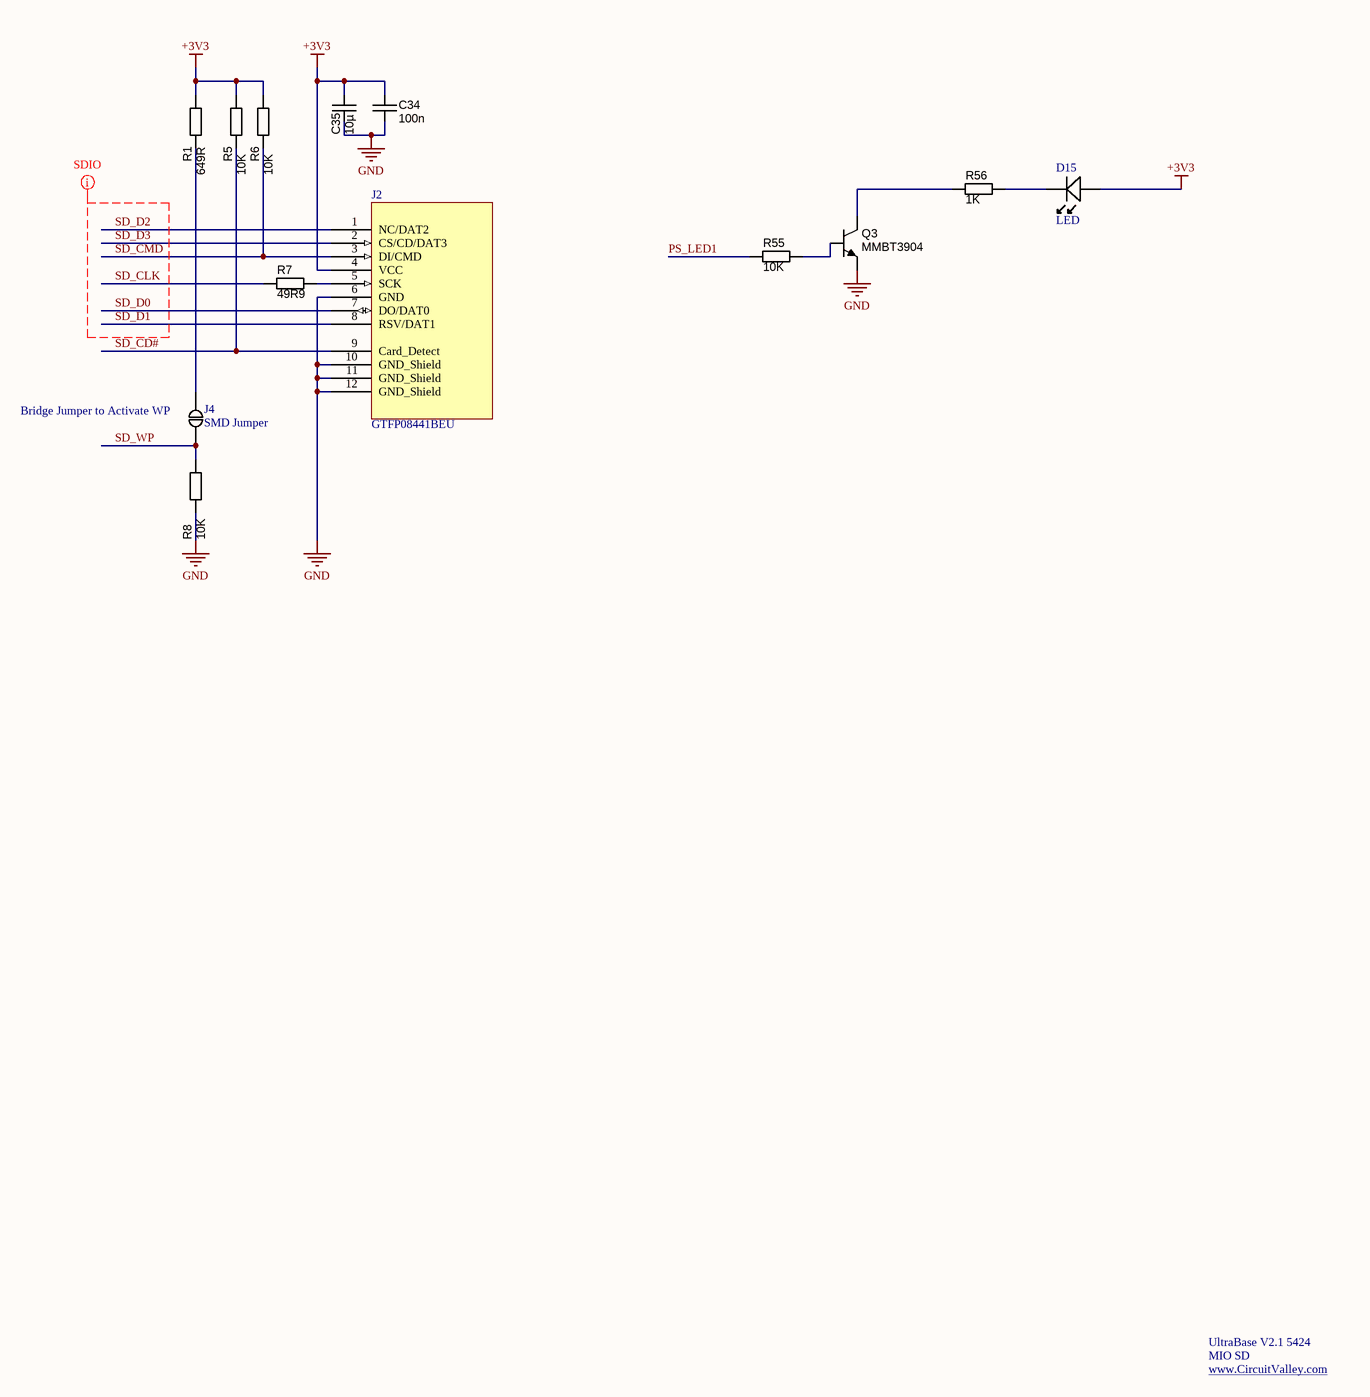
[diagram p3: MIO_SD.SchDoc]

### Parts
C34  100n  [CAPC1608N]
C35  10µ  [CAPC3225N]
D15  LED  [1206_LED]
J2  GTFP08441BEU  [GTFP08441BEU]
J4  SMD Jumper  [SMD_Jumper]  (net tie, no BOM)
Q3  Manufacturer Part Number 1: MMBT3904  [SOT23-3]  (hidden comment: NPN_MMBT3904)
R1  value 649R  [RESC1608N]  (hidden comment: RES_NL_0603)
R5  value 10K  [RESC1608N]  (hidden comment: RES_NL_0603)
R6  value 10K  [RESC1608N]  (hidden comment: RES_NL_0603)
R7  value 49R9  [RESC1608N]  (hidden comment: RES_NL_0603)
R8  value 10K  [RESC1608N]  (hidden comment: RES_NL_0603)
R55  value 10K  [RESC1608N]  (hidden comment: RES_NL_0603)
R56  value 1K  [RESC1608N]  (hidden comment: RES_NL_0603)

### Nets
+3V3: C34.1 C35.1 D15.A J2.4(VCC) R1.1 R5.1 R6.1
GND: C34.2 C35.2 J2.6(GND) J2.10(GND_Shield) J2.11(GND_Shield) J2.12(GND_Shield) Q3.2(E) R8.2
PS_LED1: R55.1
SD_CD#: J2.9(Card_Detect) R5.2
SD_CLK: R7.1
SD_CMD: J2.3(DI/CMD) R6.2
SD_D0: J2.7(DO/DAT0)
SD_D1: J2.8(RSV/DAT1)
SD_D2: J2.1(NC/DAT2)
SD_D3: J2.2(CS/CD/DAT3)
SD_WP: J4.1 R8.1
NetD15_K: D15.K R56.2
NetJ2_5: J2.5(SCK) R7.2
NetJ4_2: J4.2 R1.2
NetQ3_1: Q3.1(B) R55.2
NetQ3_3: Q3.3(C) R56.1

### Layout directives
net class SDIO: SD_CLK, SD_CMD, SD_D0, SD_D1, SD_D2, SD_D3

### Notes on the sheet
- (near J4) Bridge Jumper to Activate WP
- UltraBase V2.1 5424
- MIO SD
- www.CircuitValley.com <http://www.CircuitValley.com>

### Library data of the parts
C34 = CAPC_1n_0603_100V: Capacitor SMD Cer 1nF 10% 100V X7R 0603; Manufacturer 1: Murata Electronics North America; Manufacturer Part Number 1: GCM188R72A102KA37D; Ratings: 100V; X7R; Material: ceramic; Package / Case: 0603 (1608 metric); Tolerance: ±10%; Supplier 1: Digi-Key; Supplier Part Number 1: 490-4780-1-ND; Operating Temperature: -55°C ~ 125°C; Size / Dimension: 0.063" L x 0.031" W (1.60mm x 0.80mm); Thickness (Max): 0.035" (0.90mm); ComponentLink1URL: http://search.murata.co.jp/Ceramy/image/img/PDF/ENG/GCM188R72A102KA37.pdf; ComponentLink1Description: http://search.murata.co.jp/Ceramy/image/img/PDF/ENG/GCM188R72A102KA37.pdf; Value: 100n
C35 = CAPC_10u_1210_50V: as C5 on sheet PL_Conenctor; Package / Case: 1210 (3225 Metric); Tolerance: ±20%; Size / Dimension: 0.126" L x 0.098" W (3.20mm x 2.50mm); Supplier 1: Digi-Key; Supplier Part Number 1: 587-2225-1-ND; Value: 10µ
J2 = GTFP08441BEU: MicroSD card
J4 = SMD_Jumper
Q3 = NPN_MMBT3904: Transistor SMD NPN 40V 0.2A 350mW SOT-23; Manufacturer 1: Fairchild Semiconductor; Ratings: 40V; 200mA; 350mW; Material: Si; Package / Case: SOT-23; Supplier 1: Digi-Key; Supplier Part Number 1: MMBT3904FSCT-ND; Transistor Type: NPN; Mounting Type: Surface Mount
R1 R5-R8 R55 R56 = RES_NL_0603: as R17 on sheet PCIe; Package / Case: 0603 (1608 metric)

## Sheet POWER.SchDoc
size A3; SheetNumber: 5; SheetTotal: 13
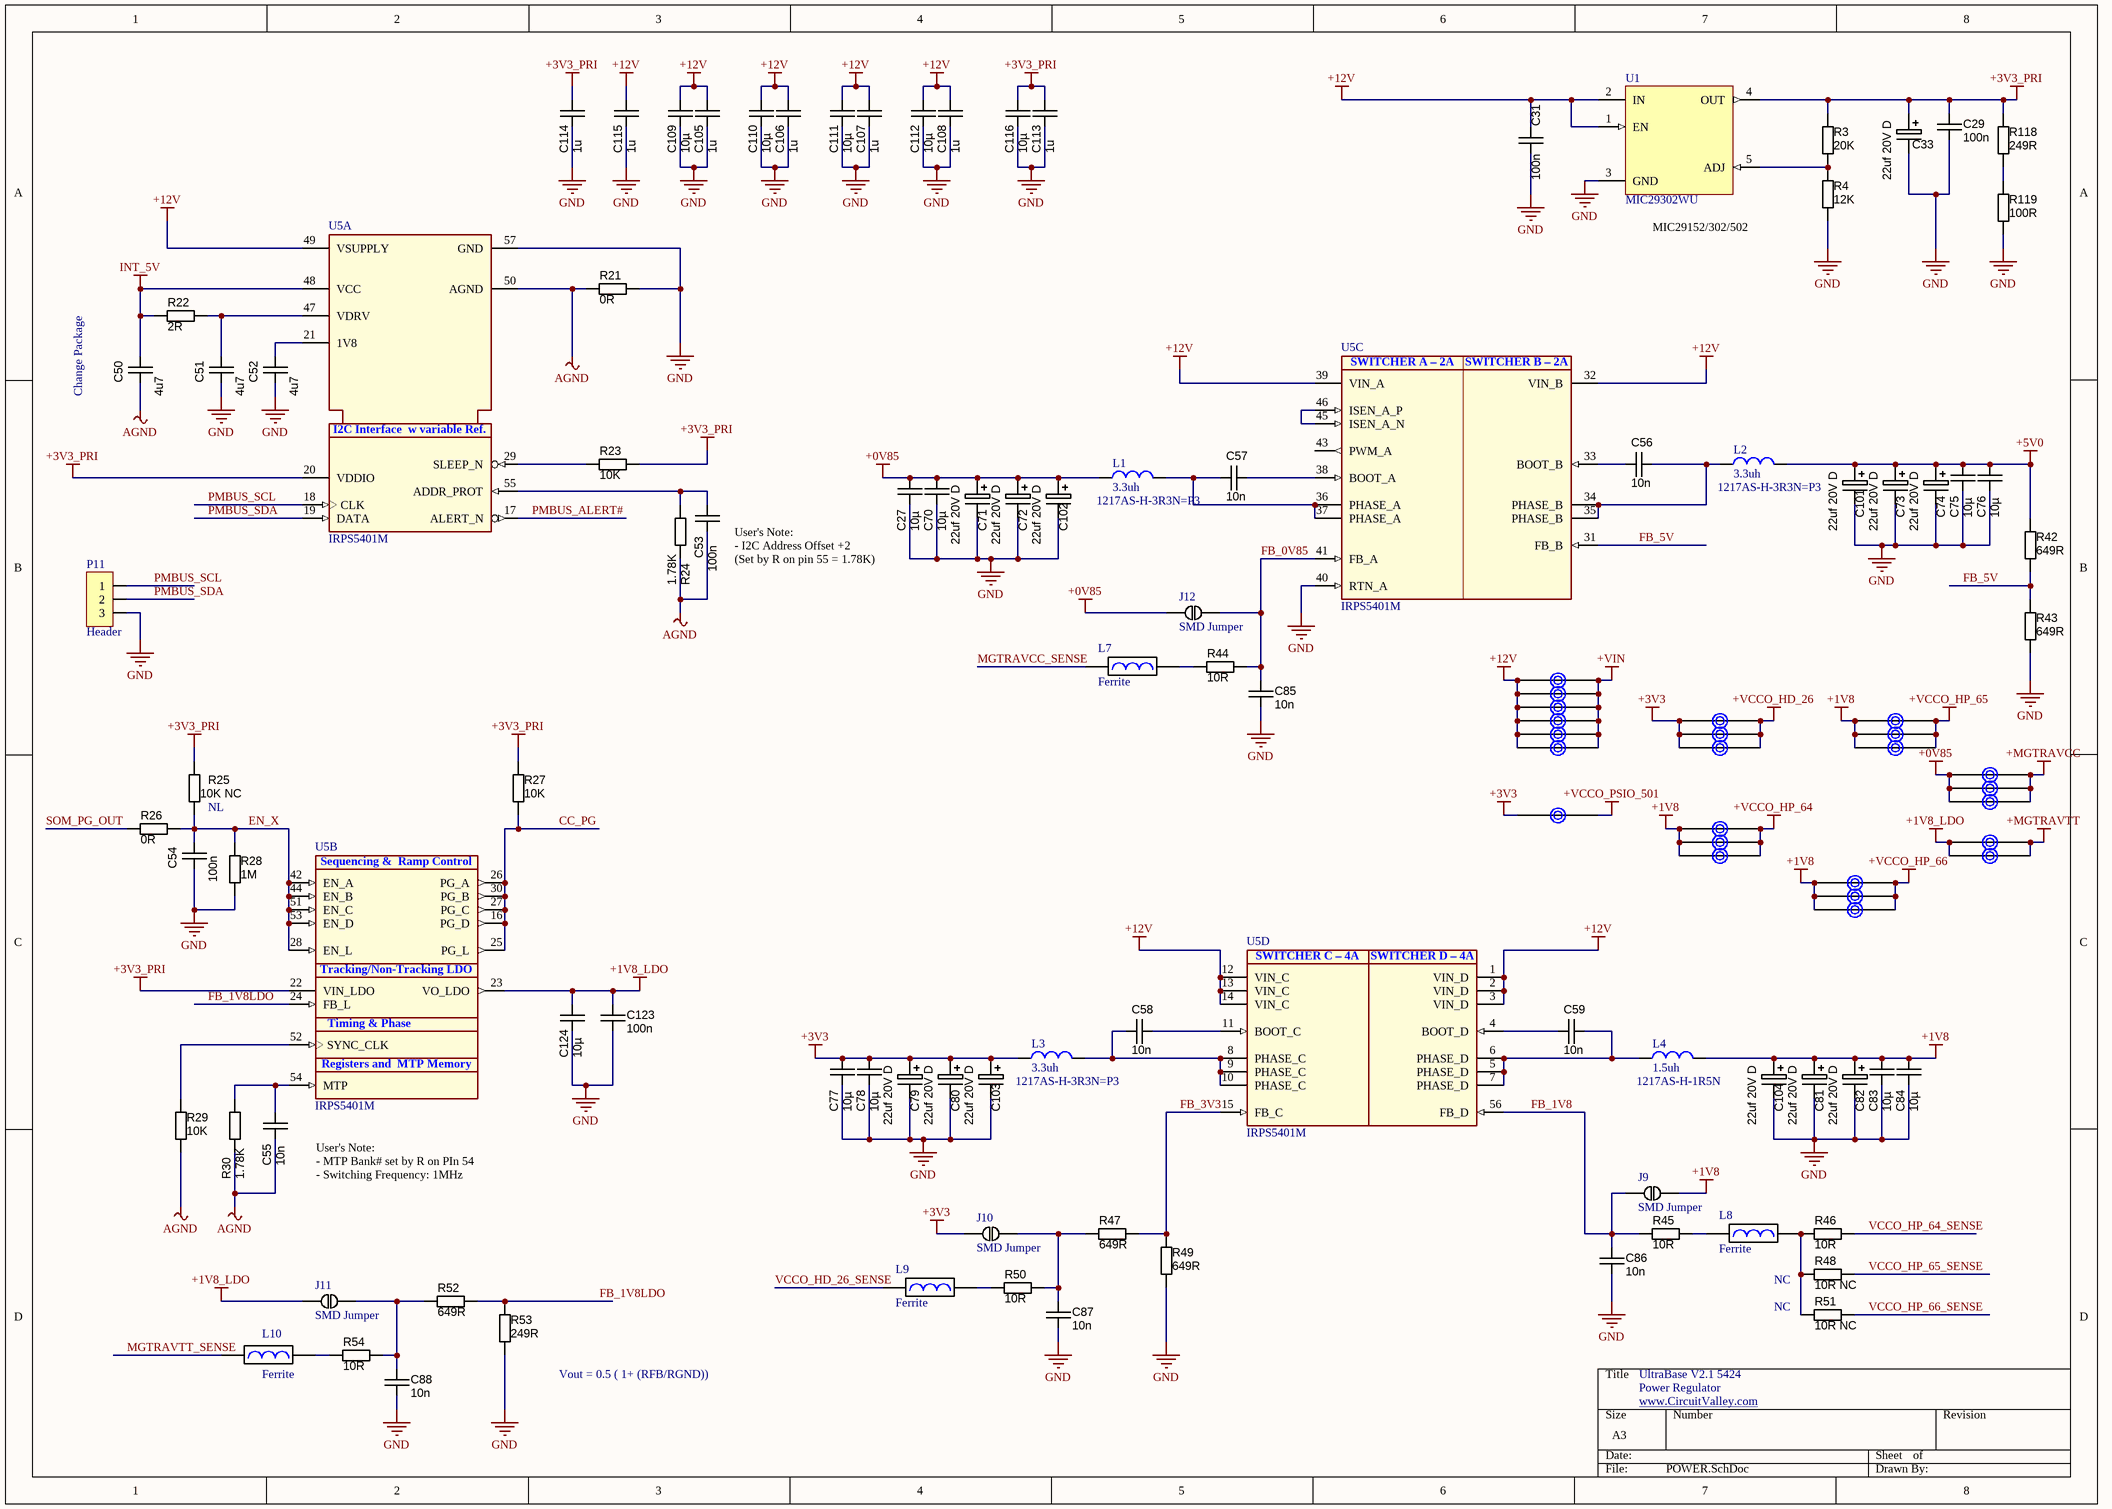
[diagram p4: POWER.SchDoc]

### Parts
C27  10µ  [CAPC3225N]
C29  100n  [CAPC1608N]
C31  100n  [CAPC1608N]
C33  value 22uf 20V D  [CAPMP7343X310N]  (hidden comment: 47uf 20V D)
C50  4u7  [CAPC1608N]
C51  4u7  [CAPC1608N]
C52  4u7  [CAPC1608N]
C53  100n  [CAPC1608N]
C54  100n  [CAPC1608N]
C55  10n  [CAPC1608N]
C56  10n  [CAPC1608N]
C57  10n  [CAPC1608N]
C58  10n  [CAPC1608N]
C59  10n  [CAPC1608N]
C70  10µ  [CAPC3225N]
C71  value 22uf 20V D  [CAPMP7343X310N]  (hidden comment: 47uf 20V D)
C72  value 22uf 20V D  [CAPMP7343X310N]  (hidden comment: 47uf 20V D)
C73  value 22uf 20V D  [CAPMP7343X310N]  (hidden comment: 47uf 20V D)
C74  value 22uf 20V D  [CAPMP7343X310N]  (hidden comment: 47uf 20V D)
C75  10µ  [CAPC3225N]
C76  10µ  [CAPC3225N]
C77  10µ  [CAPC3225N]
C78  10µ  [CAPC3225N]
C79  value 22uf 20V D  [CAPMP7343X310N]  (hidden comment: 47uf 20V D)
C80  value 22uf 20V D  [CAPMP7343X310N]  (hidden comment: 47uf 20V D)
C81  value 22uf 20V D  [CAPMP7343X310N]  (hidden comment: 47uf 20V D)
C82  value 22uf 20V D  [CAPMP7343X310N]  (hidden comment: 47uf 20V D)
C83  10µ  [CAPC3225N]
C84  10µ  [CAPC3225N]
C85  10n  [CAPC1608N]
C86  10n  [CAPC1608N]
C87  10n  [CAPC1608N]
C88  10n  [CAPC1608N]
C101  value 22uf 20V D  [CAPMP7343X310N]  (hidden comment: 47uf 20V D)
C102  value 22uf 20V D  [CAPMP7343X310N]  (hidden comment: 47uf 20V D)
C103  value 22uf 20V D  [CAPMP7343X310N]  (hidden comment: 47uf 20V D)
C104  value 22uf 20V D  [CAPMP7343X310N]  (hidden comment: 47uf 20V D)
C105  1u  [CAPC1608N]
C106  1u  [CAPC1608N]
C107  1u  [CAPC1608N]
C108  1u  [CAPC1608N]
C109  10µ  [CAPC3225N]
C110  10µ  [CAPC3225N]
C111  10µ  [CAPC3225N]
C112  10µ  [CAPC3225N]
C113  1u  [CAPC1608N]
C114  1u  [CAPC1608N]
C115  1u  [CAPC1608N]
C116  10µ  [CAPC3225N]
C123  100n  [CAPC1608N]
C124  10µ  [CAPC3225N]
J9  SMD Jumper  [SMD_Jumper]  (net tie, no BOM)
J10  SMD Jumper  [SMD_Jumper]  (net tie, no BOM)
J11  SMD Jumper  [SMD_Jumper]  (net tie, no BOM)
J12  SMD Jumper  [SMD_Jumper]  (net tie, no BOM)
L1  3.3uh  [1217AS-H-3R3N=P3]
L2  3.3uh  [1217AS-H-3R3N=P3]
L3  3.3uh  [1217AS-H-3R3N=P3]
L4  1.5uh  Part: 1217AS-H-1R5N  [1217AS-H-3R3N=P3]
L7  Ferrite  [FBC2012N]
L8  Ferrite  [FBC2012N]
L9  Ferrite  [FBC2012N]
L10  Ferrite  [FBC2012N]
P11  Header  [Header3x]
R3  value 20K  [RESC1608N]  (hidden comment: RES_NL_0603)
R4  value 12K  [RESC1608N]  (hidden comment: RES_NL_0603)
R21  value 0R  [RESC1608N]  (hidden comment: RES_NL_0603)
R22  value 2R  [RESC1608N]  (hidden comment: RES_NL_0603)
R23  value 10K  [RESC1608N]  (hidden comment: RES_NL_0603)
R24  value 1.78K  [RESC1608N]  (hidden comment: RES_NL_0603)
R25  value 10K NC  [RESC1608N]  (hidden comment: RES_NL_0603)
R26  value 0R  [RESC1608N]  (hidden comment: RES_NL_0603)
R27  value 10K  [RESC1608N]  (hidden comment: RES_NL_0603)
R28  value 1M  [RESC1608N]  (hidden comment: RES_NL_0603)
R29  value 10K  [RESC1608N]  (hidden comment: RES_NL_0603)
R30  value 1.78K  [RESC1608N]  (hidden comment: RES_NL_0603)
R42  value 649R  [RESC1608N]  (hidden comment: RES_NL_0603)
R43  value 649R  [RESC1608N]  (hidden comment: RES_NL_0603)
R44  value 10R  [RESC1608N]  (hidden comment: RES_NL_0603)
R45  value 10R  [RESC1608N]  (hidden comment: RES_NL_0603)
R46  value 10R  [RESC1608N]  (hidden comment: RES_NL_0603)
R47  value 649R  [RESC1608N]  (hidden comment: RES_NL_0603)
R48  value 10R NC  [RESC1608N]  (hidden comment: RES_NL_0603)
R49  value 649R  [RESC1608N]  (hidden comment: RES_NL_0603)
R50  value 10R  [RESC1608N]  (hidden comment: RES_NL_0603)
R51  value 10R NC  [RESC1608N]  (hidden comment: RES_NL_0603)
R52  value 649R  [RESC1608N]  (hidden comment: RES_NL_0603)
R53  value 249R  [RESC1608N]  (hidden comment: RES_NL_0603)
R54  value 10R  [RESC1608N]  (hidden comment: RES_NL_0603)
R118  value 249R  [RESC1608N]  (hidden comment: RES_NL_0603)
R119  value 100R  [RESC1608N]  (hidden comment: RES_NL_0603)
T1  net_tie  [net_tie_0mm5]  (value not drawn)  (net tie, no BOM)
T2  net_tie  [net_tie_0mm5]  (value not drawn)  (net tie, no BOM)
T3  net_tie  [net_tie_0mm5]  (value not drawn)  (net tie, no BOM)
T4  net_tie  [net_tie_0mm5]  (value not drawn)  (net tie, no BOM)
T5  net_tie  [net_tie_0mm5]  (value not drawn)  (net tie, no BOM)
T6  net_tie  [net_tie_0mm5]  (value not drawn)  (net tie, no BOM)
T7  net_tie  [net_tie_0mm5]  (value not drawn)  (net tie, no BOM)
T8  net_tie  [net_tie_0mm5]  (value not drawn)  (net tie, no BOM)
T9  net_tie  [net_tie_0mm5]  (value not drawn)  (net tie, no BOM)
T10  net_tie  [net_tie_0mm5]  (value not drawn)  (net tie, no BOM)
T11  net_tie  [net_tie_0mm5]  (value not drawn)  (net tie, no BOM)
T12  net_tie  [net_tie_0mm5]  (value not drawn)  (net tie, no BOM)
T13  net_tie  [net_tie_0mm5]  (value not drawn)  (net tie, no BOM)
T14  net_tie  [net_tie_0mm5]  (value not drawn)  (net tie, no BOM)
T15  net_tie  [net_tie_0mm5]  (value not drawn)  (net tie, no BOM)
T16  net_tie  [net_tie_0mm5]  (value not drawn)  (net tie, no BOM)
T17  net_tie  [net_tie_0mm5]  (value not drawn)  (net tie, no BOM)
T18  net_tie  [net_tie_0mm5]  (value not drawn)  (net tie, no BOM)
T19  net_tie  [net_tie_0mm5]  (value not drawn)  (net tie, no BOM)
T20  net_tie  [net_tie_0mm5]  (value not drawn)  (net tie, no BOM)
T21  net_tie  [net_tie_0mm5]  (value not drawn)  (net tie, no BOM)
T22  net_tie  [net_tie_0mm5]  (value not drawn)  (net tie, no BOM)
T23  net_tie  [net_tie_0mm5]  (value not drawn)  (net tie, no BOM)
T24  net_tie  [net_tie_0mm5]  (value not drawn)  (net tie, no BOM)
U1  MIC29302WU  [TO-263-5]
U5  IRPS5401M  [INF-PG-QFN-56-7X7]  (parts A,B,C,D of 4)

### Nets
+0V85: C27.1 C70.1 C71.1 C72.1 C102.1 J12.1 L1.1 T8.1(PAD) T9.1(PAD) T10.1(PAD)
+1V8: C81.1 C82.1 C83.1 C84.1 C104.1 J9.2 L4.2 T3.1(PAD) T5.1(PAD) T7.1(PAD) T12.1(PAD) T13.1(PAD) T15.1(PAD) T17.1(PAD) T18.1(PAD) T19.1(PAD)
+1V8_LDO: C123.2 C124.1 J11.1 T14.1(PAD) T16.1(PAD) U5.23(VO_LDO)
+3V3: C77.1 C78.1 C79.1 C80.1 C103.1 J10.1 L3.1 T2.1(PAD) T4.1(PAD) T6.1(PAD) T11.1(PAD)
+3V3_PRI: C29.1 C33.1 C113.2 C114.2 C116.1 R3.1 R23.1 R25.2 R27.2 R118.1 U1.4(OUT) U5.20(VDDIO) U5.22(VIN_LDO)
+5V0: C73.1 C74.1 C75.1 C76.1 C101.1 L2.2 R42.1
+12V: C31.1 C105.2 C106.2 C107.2 C108.2 C109.1 C110.1 C111.1 C112.1 C115.2 T1.1(PAD) T20.1(PAD) T21.1(PAD) T22.1(PAD) T23.1(PAD) T24.1(PAD) U1.1(EN) U1.2(IN) U5.1(VIN_D) U5.2(VIN_D) U5.3(VIN_D) U5.12(VIN_C) U5.13(VIN_C) U5.14(VIN_C) U5.32(VIN_B) U5.39(VIN_A) U5.49(VSUPPLY)
+MGTRAVCC: T8.2(PAD) T9.2(PAD) T10.2(PAD)
+MGTRAVTT: T14.2(PAD) T16.2(PAD)
+VCCO_HD_26: T2.2(PAD) T4.2(PAD) T6.2(PAD)
+VCCO_HP_64: T12.2(PAD) T13.2(PAD) T15.2(PAD)
+VCCO_HP_65: T3.2(PAD) T5.2(PAD) T7.2(PAD)
+VCCO_HP_66: T17.2(PAD) T18.2(PAD) T19.2(PAD)
+VCCO_PSIO_501: T11.2(PAD)
+VIN: T1.2(PAD) T20.2(PAD) T21.2(PAD) T22.2(PAD) T23.2(PAD) T24.2(PAD)
AGND: C50.2 C53.2 C55.2 R21.1 R24.1 R29.2 R30.2 U5.50(AGND)
GND: C27.2 C29.2 C31.2 C33.2 C51.2 C52.2 C54.2 C70.2 C71.2 C72.2 C73.2 C74.2 C75.2 C76.2 C77.2 C78.2 C79.2 C80.2 C81.2 C82.2 C83.2 C84.2 C85.1 C86.1 C87.1 C88.1 C101.2 C102.2 C103.2 C104.2 C105.1 C106.1 C107.1 C108.1 C109.2 C110.2 C111.2 C112.2 C113.1 C114.1 C115.1 C116.2 C123.1 C124.2 P11.3 R4.2 R21.2 R28.2 R43.2 R49.1 R53.1 R119.2 U1.3(GND) U5.40(RTN_A) U5.57(GND)
INT_5V: C50.1 R22.1 U5.48(VCC)
CC_PG: R27.1 U5.16(PG_D) U5.25(PG_L) U5.26(PG_A) U5.27(PG_C) U5.30(PG_B)
EN_X: C54.1 R25.1 R26.1 R28.1 U5.28(EN_L) U5.42(EN_A) U5.44(EN_B) U5.51(EN_C) U5.53(EN_D)
FB_0V85: C85.2 J12.2 R44.2 U5.41(FB_A)
FB_1V8: C86.2 J9.1 R45.1 U5.56(FB_D)
FB_1V8LDO: R52.2 R53.2 U5.24(FB_L)
FB_3V3: R47.2 R49.2 U5.15(FB_C)
FB_5V: R42.2 R43.1 U5.31(FB_B)
MGTRAVCC_SENSE: L7.1
MGTRAVTT_SENSE: L10.1
PMBUS_ALERT#: U5.17(ALERT_N)
PMBUS_SCL: P11.1 U5.18(CLK)
PMBUS_SDA: P11.2 U5.19(DATA)
SOM_PG_OUT: R26.2
VCCO_HD_26_SENSE: L9.1
VCCO_HP_64_SENSE: R46.2
VCCO_HP_65_SENSE: R48.2
VCCO_HP_66_SENSE: R51.2
NetC51_1: C51.1 R22.2 U5.47(VDRV)
NetC52_1: C52.1 U5.21(1V8)
NetC53_1: C53.1 R24.2 U5.55(ADDR_PROT)
NetC55_1: C55.1 R30.1 U5.54(MTP)
NetC56_1: C56.1 U5.33(BOOT_B)
NetC56_2: C56.2 L2.1 U5.34(PHASE_B) U5.35(PHASE_B)
NetC57_1: C57.1 L1.2 U5.36(PHASE_A) U5.37(PHASE_A)
NetC57_2: C57.2 U5.38(BOOT_A)
NetC58_1: C58.1 L3.2 U5.8(PHASE_C) U5.9(PHASE_C) U5.10(PHASE_C)
NetC58_2: C58.2 U5.11(BOOT_C)
NetC59_1: C59.1 U5.4(BOOT_D)
NetC59_2: C59.2 L4.1 U5.5(PHASE_D) U5.6(PHASE_D) U5.7(PHASE_D)
NetC87_2: C87.2 J10.2 R47.1 R50.2
NetC88_2: C88.2 J11.2 R52.1 R54.2
NetL7_2: L7.2 R44.1
NetL8_1: L8.1 R45.2
NetL8_2: L8.2 R46.1 R48.1 R51.1
NetL9_2: L9.2 R50.1
NetL10_2: L10.2 R54.1
NetR3_2: R3.2 R4.1 U1.5(ADJ)
NetR23_2: R23.2 U5.29(SLEEP_N)
NetR29_1: R29.1 U5.52(SYNC_CLK)
NetR118_2: R118.2 R119.1
NetU5_45: U5.45(ISEN_A_N) U5.46(ISEN_A_P)

Not connected (* = marked no-connect by the designer): U5 43(PWM_A)

### Notes on the sheet
- (near U1) MIC29152/302/502
- Change Package
- User's Note:
  - I2C Address Offset +2
  (Set by R on pin 55 = 1.78K)
- (near R25) NL
- User's Note:
  - MTP Bank# set by R on PIn 54
  - Switching Frequency: 1MHz
- NC
- Vout = 0.5 ( 1+ (RFB/RGND))
- UltraBase V2.1 5424
- Power Regulator
- www.CircuitValley.com <http://www.CircuitValley.com>
- (in symbol IRPS5401M, part A) I2C Interface  w variable Ref.
- (in symbol IRPS5401M, part B) Sequencing &  Ramp Control; Tracking/Non-Tracking LDO; Timing & Phase; Registers and  MTP Memory
- (in symbol IRPS5401M, part C) SWITCHER A – 2A; SWITCHER B – 2A
- (in symbol IRPS5401M, part D) SWITCHER C – 4A; SWITCHER D – 4A

### Library data of the parts
C27 C70 C75-C78 C83 C84 C109-C112 C116 C124 = CAPC_10u_1210_50V: as C5 on sheet PL_Conenctor; Package / Case: 1210 (3225 Metric); Tolerance: ±20%; Size / Dimension: 0.126" L x 0.098" W (3.20mm x 2.50mm); Supplier 1: Digi-Key; Supplier Part Number 1: 587-2225-1-ND; Value: 10µ
C29 C31 = CAPC_1n_0603_100V: as C34 on sheet MIO_SD; Package / Case: 0603 (1608 metric); Tolerance: ±10%; Supplier 1: Digi-Key; Supplier Part Number 1: 490-4780-1-ND; Operating Temperature: -55°C ~ 125°C; Size / Dimension: 0.063" L x 0.031" W (1.60mm x 0.80mm); Thickness (Max): 0.035" (0.90mm); ComponentLink1URL: http://search.murata.co.jp/Ceramy/image/img/PDF/ENG/GCM188R72A102KA37.pdf; ComponentLink1Description: http://search.murata.co.jp/Ceramy/image/img/PDF/ENG/GCM188R72A102KA37.pdf; Value: 100n
C33 = CAPT_330u_2917_6V3: Capacitor SMD Tant 330uF 20% 6V3 2917; Manufacturer Part Number: T520D337M006ATE015; Part: TAJD336K020R; Ratings: 6.3V; Material: Solid Tantalum; ESR (Equivalent Series Resistance): 15 mOhm; Package / Case: 2917 (7343 Metric); Tolerance: ±20%; Operating Temperature: -55°C ~ 125°C; Size / Dimension: 0.287" L x 0.169" W (7.30mm x 4.30mm); Height - Seated (Max): 0.122" (3.10mm); Manufacturer Size Code: D; Supplier 1: Digi-Key; Supplier Part Number 1: 399-4052-1-ND; ComponentLink1URL: http://www.kemet.com/datasheets&T520D337M006ATE015; ComponentLink1Description: T520D Datasheet
C50-C59 C85-C88 C105-C108 C113-C115 C123 = CAPC_120p_0603_C0G_50V: as C22 on sheet PCIe; Tolerance: ±10%; Operating Temperature: -55°C ~ 125°C; Package / Case: 0603 (1608 Metric); Supplier 1: Mouser; Supplier Part Number 1: 80-C0603C121K5G
  C50-C52: Value: 4u7
  C53 C54 C123: Value: 100n
  C55-C59 C85-C88: Value: 10n
  C105-C108 C113-C115: Value: 1u
C71-C74 C79-C82 C101-C104 = CAPT_330u_2917_6V3: as C61 on sheet PCIe; Package / Case: 2917 (7343 Metric); Tolerance: ±20%; Operating Temperature: -55°C ~ 125°C; Size / Dimension: 0.287" L x 0.169" W (7.30mm x 4.30mm); Height - Seated (Max): 0.122" (3.10mm); Manufacturer Size Code: D; Supplier 1: Digi-Key; Supplier Part Number 1: 399-4052-1-ND; ComponentLink1URL: http://www.kemet.com/datasheets&T520D337M006ATE015; ComponentLink1Description: T520D Datasheet
J9-J12 = SMD_Jumper
L1-L4 = inductor_smd
  L1-L3: Part: 1217AS-H-3R3N=P3
L7-L10 = Ferrite Bead
P11 = Header_3Pin: 3 Pin Header
R3 R4 R21-R30 R42-R54 R118 R119 = RES_NL_0603: as R17 on sheet PCIe; Package / Case: 0603 (1608 metric)
U5 = IRPS5401M: PMIC Flexible Power Management Unit; Manufacturer: Infineon Technologies; PackageReference: QFN 7X7 56L; ManufacturerPartNumber: IRPS5401M

## Sheet Ethernet.SchDoc
size A3; SheetNumber: 6; SheetTotal: 13
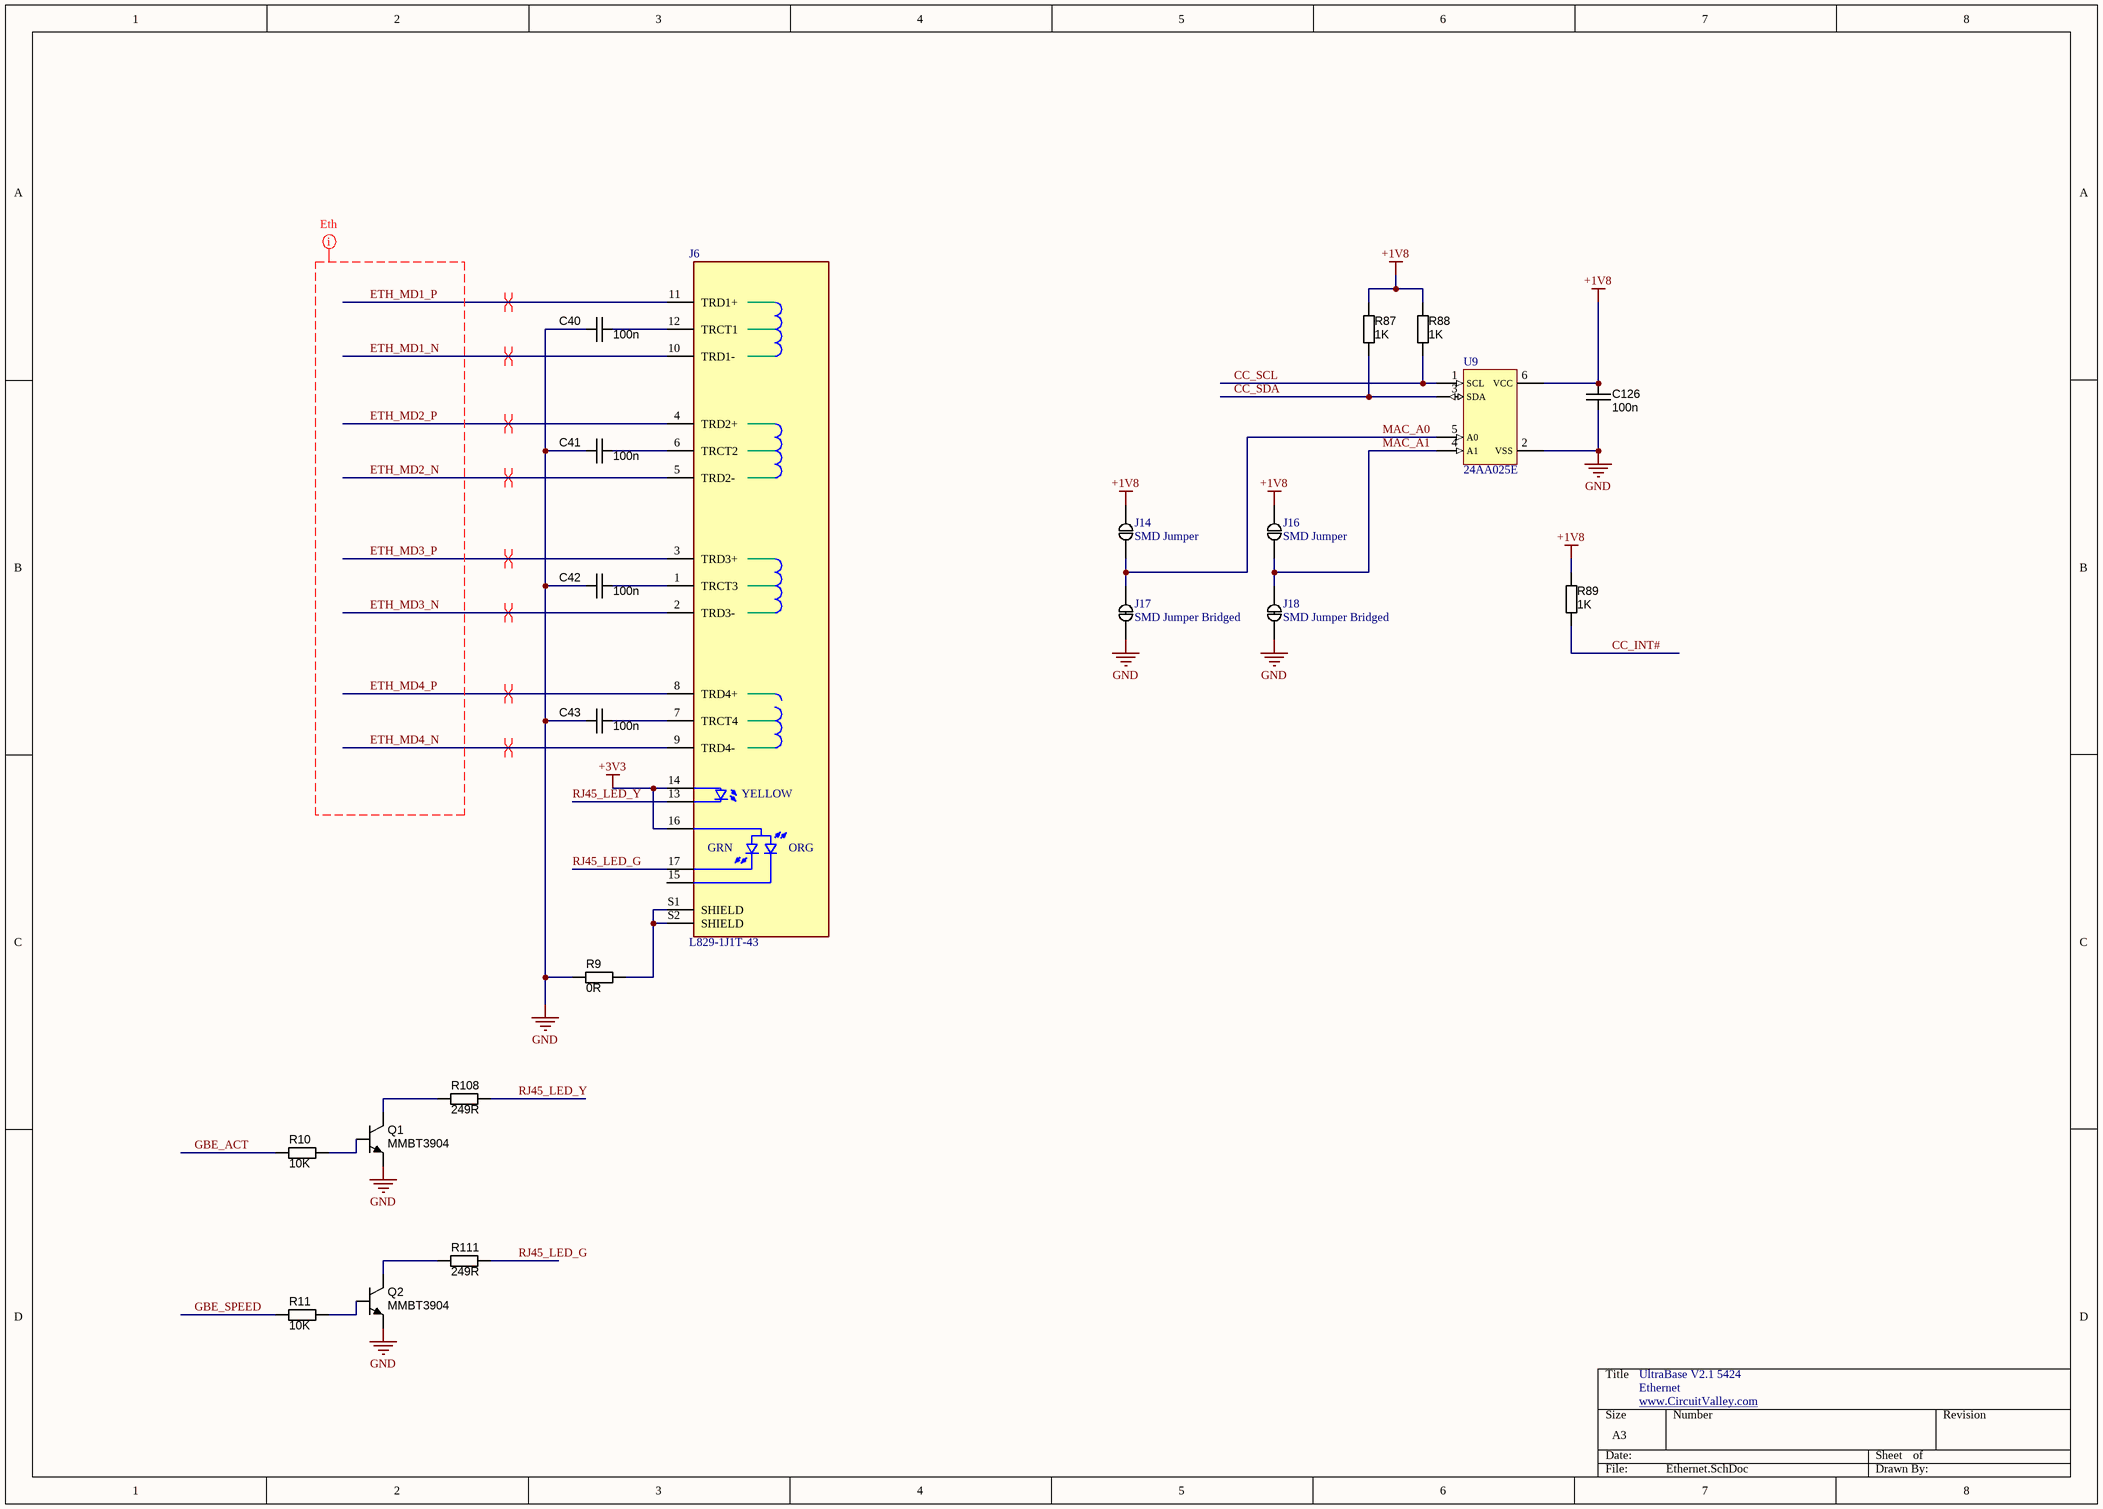
[diagram p5: Ethernet.SchDoc]

### Parts
C40  100n  [CAPC1608N]
C41  100n  [CAPC1608N]
C42  100n  [CAPC1608N]
C43  100n  [CAPC1608N]
C126  100n  [CAPC1608N]
J6  L829-1J1T-43  [L829-1J1T-43]
J14  SMD Jumper  [SMD_Jumper]  (net tie, no BOM)
J16  SMD Jumper  [SMD_Jumper]  (net tie, no BOM)
J17  SMD Jumper Bridged  [SMD_Jumper_bridge]  (net tie, no BOM)
J18  SMD Jumper Bridged  [SMD_Jumper_bridge]  (net tie, no BOM)
Q1  Manufacturer Part Number 1: MMBT3904  [SOT23-3]  (hidden comment: NPN_MMBT3904)
Q2  Manufacturer Part Number 1: MMBT3904  [SOT23-3]  (hidden comment: NPN_MMBT3904)
R9  value 0R  [RESC1608N]  (hidden comment: RES_NL_0603)
R10  value 10K  [RESC1608N]  (hidden comment: RES_NL_0603)
R11  value 10K  [RESC1608N]  (hidden comment: RES_NL_0603)
R87  value 1K  [RESC1608N]  (hidden comment: RES_NL_0603)
R88  value 1K  [RESC1608N]  (hidden comment: RES_NL_0603)
R89  value 1K  [RESC1608N]  (hidden comment: RES_NL_0603)
R108  value 249R  [RESC1608N]  (hidden comment: RES_NL_0603)
R111  value 249R  [RESC1608N]  (hidden comment: RES_NL_0603)
U9  24AA025E  [SOT23-6]

### Nets
+1V8: C126.2 J14.2 J16.2 R87.2 R88.2 R89.2 U9.6(VCC)
+3V3: J6.14(YA_1) J6.16(CA)
GND: C40.1 C41.1 C42.1 C43.1 C126.1 J17.1 J18.1 Q1.2(E) Q2.2(E) R9.1 U9.2(VSS)
CC_INT#: R89.1
CC_SCL: R88.1 U9.1(SCL)
CC_SDA: R87.1 U9.3(SDA)
ETH_MD1_N: J6.10(TRD1-)
ETH_MD1_P: J6.11(TRD1+)
ETH_MD2_N: J6.5(TRD2-)
ETH_MD2_P: J6.4(TRD2+)
ETH_MD3_N: J6.2(TRD3-)
ETH_MD3_P: J6.3(TRD3+)
ETH_MD4_N: J6.9(TRD4-)
ETH_MD4_P: J6.8(TRD4+)
GBE_ACT: R10.1
GBE_SPEED: R11.1
MAC_A0: J14.1 J17.2 U9.5(A0)
MAC_A1: J16.1 J18.2 U9.4(A1)
RJ45_LED_G: J6.17(GK_1) R111.2
RJ45_LED_Y: J6.13(YK_1) R108.2
NetC40_2: C40.2 J6.12(TRCT1)
NetC41_2: C41.2 J6.6(TRCT2)
NetC42_2: C42.2 J6.1(TRCT3)
NetC43_2: C43.2 J6.7(TRCT4)
NetJ6_S1: J6.S1(SHIELD) J6.S2(SHIELD) R9.2
NetQ1_1: Q1.1(B) R10.2
NetQ1_3: Q1.3(C) R108.1
NetQ2_1: Q2.1(B) R11.2
NetQ2_3: Q2.3(C) R111.1

Not connected (* = marked no-connect by the designer): J6 15(OK_1)

### Layout directives
differential pair: ETH_MD1_N, ETH_MD1_P, ETH_MD2_N, ETH_MD2_P, ETH_MD3_N, ETH_MD3_P, ETH_MD4_N, ETH_MD4_P
net class EtherNETETH_MD: ETH_MD1_N, ETH_MD1_P, ETH_MD2_N, ETH_MD2_P, ETH_MD3_N, ETH_MD3_P, ETH_MD4_N, ETH_MD4_P

### Notes on the sheet
- UltraBase V2.1 5424
- Ethernet
- www.CircuitValley.com <http://www.CircuitValley.com>
- (in symbol L829-1J1T-43) YELLOW; GRN; ORG

### Library data of the parts
C40-C43 C126 = CAPC_1n_0603_100V: as C34 on sheet MIO_SD; Package / Case: 0603 (1608 metric); Tolerance: ±10%; Supplier 1: Digi-Key; Supplier Part Number 1: 490-4780-1-ND; Operating Temperature: -55°C ~ 125°C; Size / Dimension: 0.063" L x 0.031" W (1.60mm x 0.80mm); Thickness (Max): 0.035" (0.90mm); ComponentLink1URL: http://search.murata.co.jp/Ceramy/image/img/PDF/ENG/GCM188R72A102KA37.pdf; ComponentLink1Description: http://search.murata.co.jp/Ceramy/image/img/PDF/ENG/GCM188R72A102KA37.pdf; Value: 100n
J6 = L829-1J1T-43: MagJack 1000BASE-T | 1X1 | 3w-OG/Y | Tab Up | Low Profile | RoHS; MF: Bel Fuse; Value: *; Availability: Unavailable; Package: None; SnapEDA_Link: https://www.snapeda.com/parts/L829-1J1T-43/Bel%20Fuse%20Inc./view-part/562341/?ref=snap; Price: None; MP: L829-1J1T-43
J14 J16 = SMD_Jumper
J17 J18 = SMD_Jumper_Bridged: SMD Jumper
Q1 Q2 = NPN_MMBT3904: as Q3 on sheet MIO_SD; Package / Case: SOT-23; Supplier 1: Digi-Key; Supplier Part Number 1: MMBT3904FSCT-ND; Transistor Type: NPN; Mounting Type: Surface Mount
R9-R11 R87-R89 R108 R111 = RES_NL_0603: as R17 on sheet PCIe; Package / Case: 0603 (1608 metric)
U9 = 24AA025E: MAC EEPROM

## Sheet DisplayPort.SchDoc
size A3; SheetNumber: 7; SheetTotal: 13
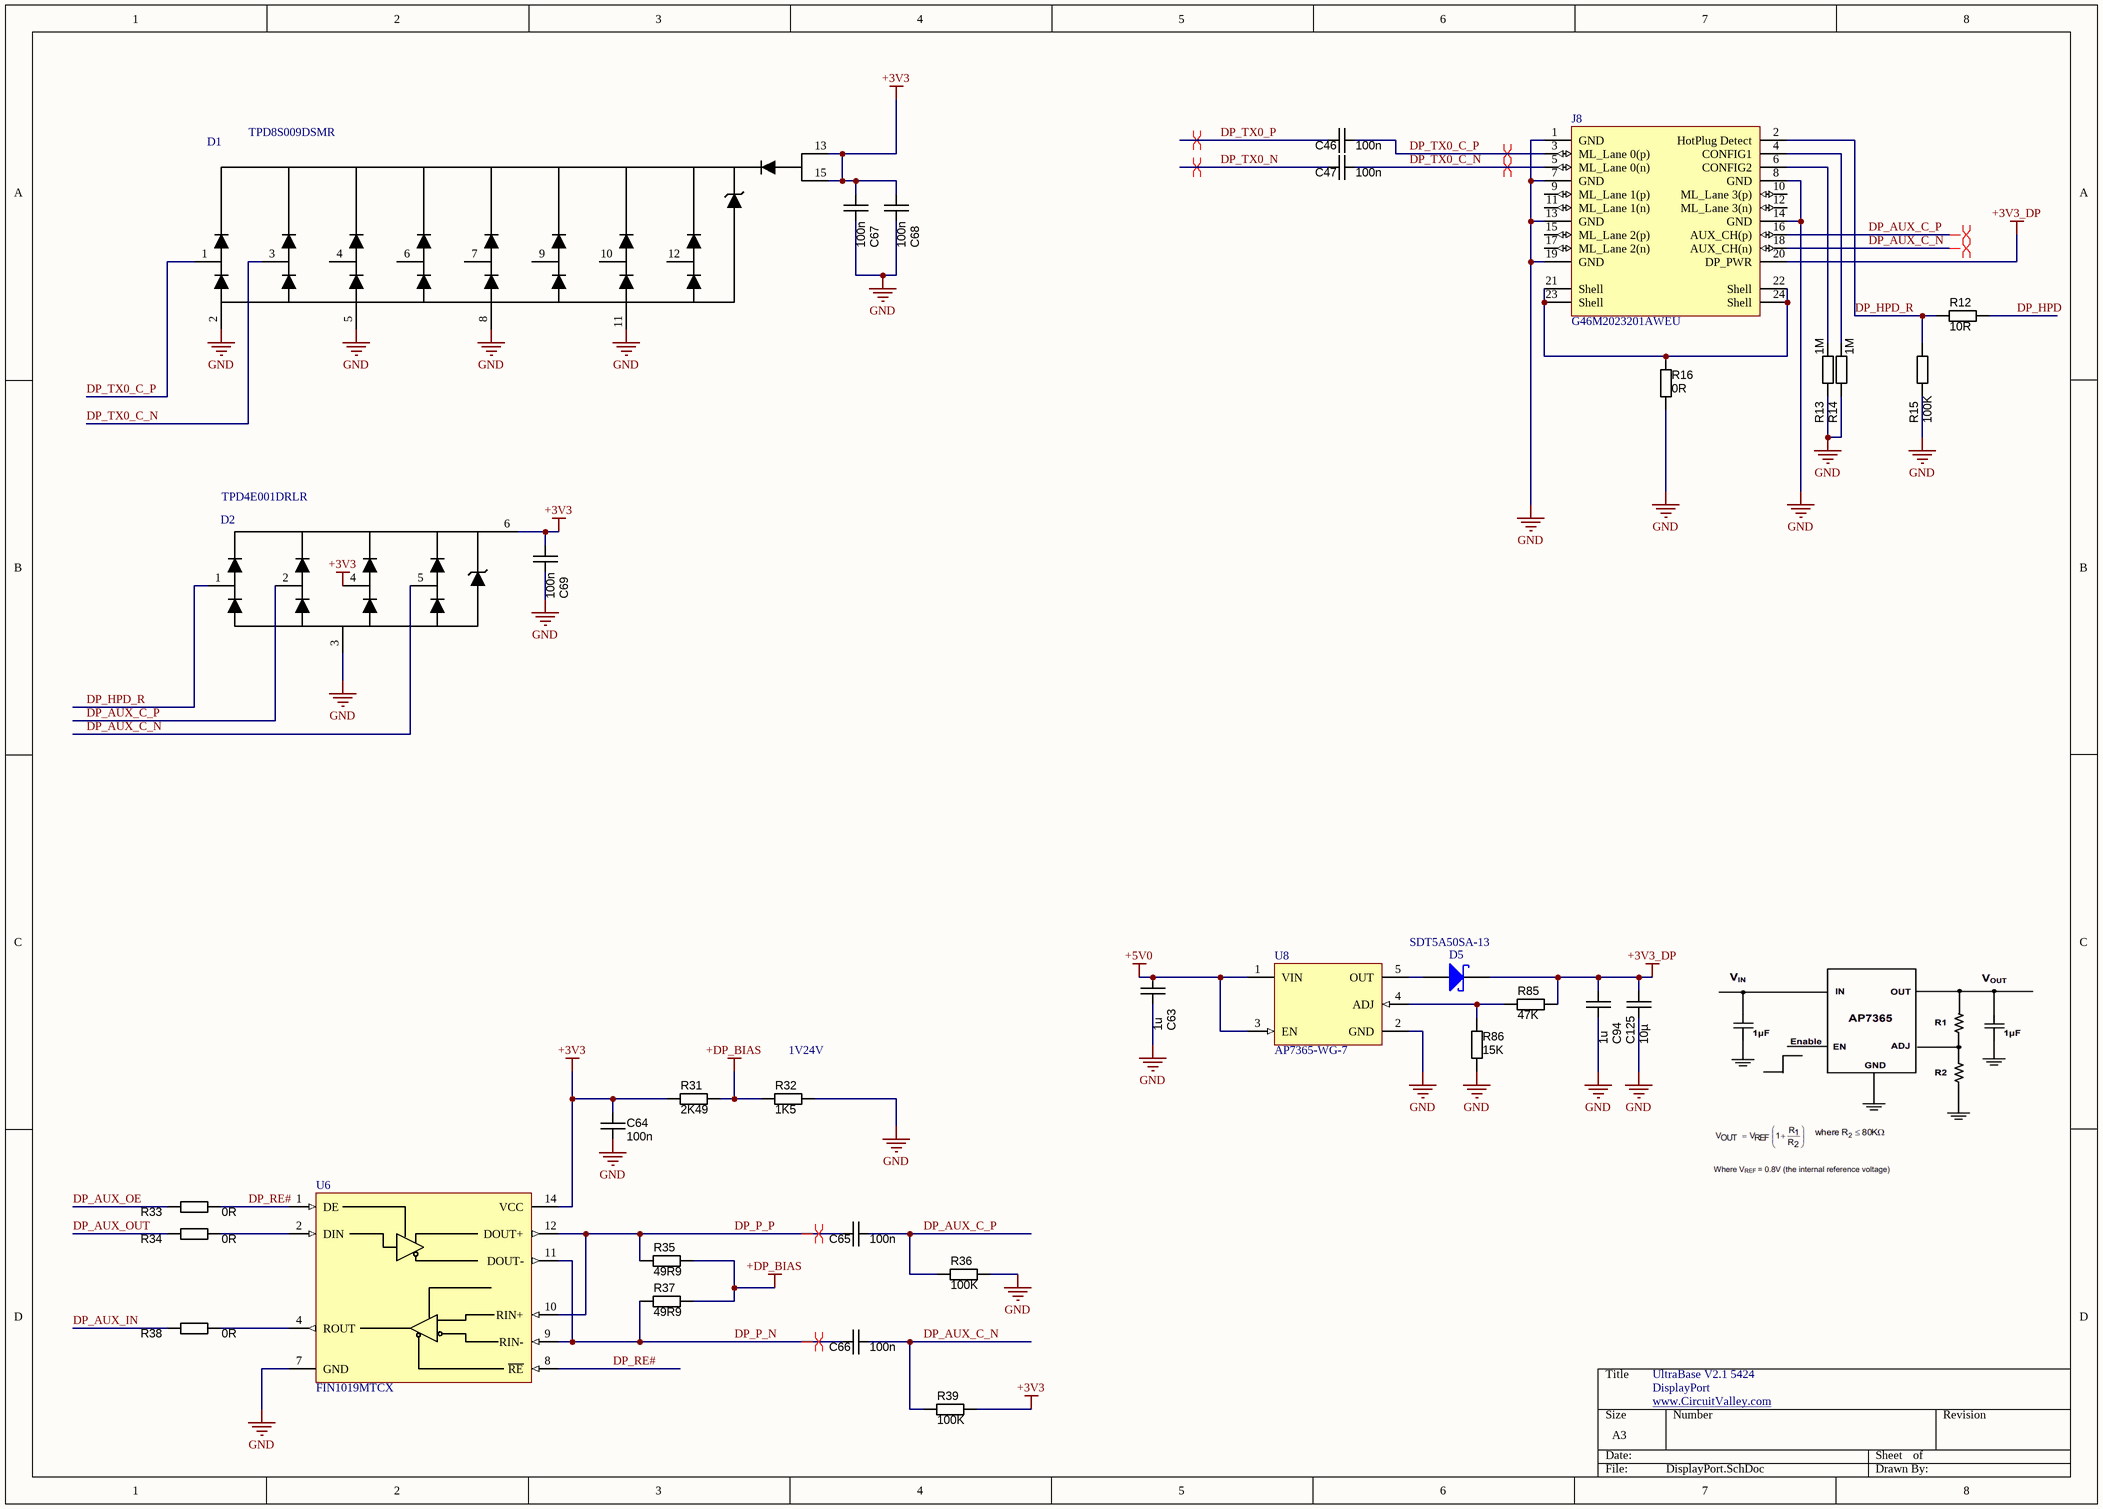
[diagram p6: DisplayPort.SchDoc]

### Parts
C46  100n  [CAPC1005N]
C47  100n  [CAPC1005N]
C63  1u  [CAPC1608N]
C64  100n  [CAPC1608N]
C65  100n  [CAPC1005N]
C66  100n  [CAPC1005N]
C67  100n  [CAPC1608N]
C68  100n  [CAPC1608N]
C69  100n  [CAPC1608N]
C94  1u  [CAPC1608N]
C125  10µ  [CAPC3225N]
D1  TPD8S009DSMR  [WSON-15]
D2  TPD4E001DRLR  [SOT5x3]
D5  SDT5A50SA-13  [DO-214AC]
J8  G46M2023201AWEU  [G46M2023201AWEU]
R12  value 10R  [RESC1608N]  (hidden comment: RES_NL_0603)
R13  value 1M  [RESC1608N]  (hidden comment: RES_NL_0603)
R14  value 1M  [RESC1608N]  (hidden comment: RES_NL_0603)
R15  value 100K  [RESC1608N]  (hidden comment: RES_NL_0603)
R16  value 0R  [RESC1608N]  (hidden comment: RES_NL_0603)
R31  value 2K49  [RESC1608N]  (hidden comment: RES_NL_0603)
R32  value 1K5  [RESC1608N]  (hidden comment: RES_NL_0603)
R33  value 0R  [RESC1608N]  (hidden comment: RES_NL_0603)
R34  value 0R  [RESC1608N]  (hidden comment: RES_NL_0603)
R35  value 49R9  [RESC1608N]  (hidden comment: RES_NL_0603)
R36  value 100K  [RESC1608N]  (hidden comment: RES_NL_0603)
R37  value 49R9  [RESC1608N]  (hidden comment: RES_NL_0603)
R38  value 0R  [RESC1608N]  (hidden comment: RES_NL_0603)
R39  value 100K  [RESC1608N]  (hidden comment: RES_NL_0603)
R85  value 47K  [RESC1608N]  (hidden comment: RES_NL_0603)
R86  value 15K  [RESC1608N]  (hidden comment: RES_NL_0603)
U6  FIN1019MTCX  [TSSOP14 PW G14]
U8  AP7365-WG-7  [SOT23-5]

### Nets
+3V3: C64.1 C67.1 C68.1 C69.1 D1.13 D1.15 D2.4 D2.6 R31.1 R39.1 U6.14(VCC)
+3V3_DP: C94.1 C125.1 D5.2(K) J8.20(DP_PWR) R85.2
+5V0: C63.1 U8.1(VIN) U8.3(EN)
+DP_BIAS: R31.2 R32.1 R35.1 R37.2
GND: C63.2 C64.2 C67.2 C68.2 C69.2 C94.2 C125.2 D1.2 D1.5 D1.8 D1.11 D2.3 J8.1(GND) J8.7(GND) J8.8(GND) J8.13(GND) J8.14(GND) J8.19(GND) R13.2 R14.2 R15.2 R16.2 R32.2 R36.1 R86.1 U6.7(GND) U8.2(GND)
DP_AUX_C_N: C66.2 D2.5 J8.18(AUX_CH(n)) R39.2
DP_AUX_C_P: C65.2 D2.2 J8.16(AUX_CH(p)) R36.2
DP_AUX_IN: R38.1
DP_AUX_OE: R33.1
DP_AUX_OUT: R34.1
DP_HPD: R12.2
DP_HPD_R: D2.1 J8.2(HotPlug_Detect) R12.1 R15.1
DP_P_N: C66.1 R37.1 U6.9(RIN-) U6.11(DOUT-)
DP_P_P: C65.1 R35.2 U6.10(RIN+) U6.12(DOUT+)
DP_RE#: R33.2 U6.1(DE) U6.8(~{RE})
DP_TX0_C_N: C47.2 D1.3 J8.5(ML_Lane_0(n))
DP_TX0_C_P: C46.2 D1.1 J8.3(ML_Lane_0(p))
DP_TX0_N: C47.1
DP_TX0_P: C46.1
NetD5_1: D5.1(A) U8.5(OUT)
NetJ8_4: J8.4(CONFIG1) R14.1
NetJ8_6: J8.6(CONFIG2) R13.1
NetJ8_21: J8.21(Shell) J8.22(Shell) J8.23(Shell) J8.24(Shell) R16.1
NetR34_2: R34.2 U6.2(DIN)
NetR38_2: R38.2 U6.4(ROUT)
NetR85_1: R85.1 R86.2 U8.4(ADJ)

Not connected (* = marked no-connect by the designer): D1 4 6 7 9 10 12; J8 9(ML_Lane_1(p)) 10(ML_Lane_3(p)) 11(ML_Lane_1(n)) 12(ML_Lane_3(n)) 15(ML_Lane_2(p)) 17(ML_Lane_2(n))

### Layout directives
differential pair: DP_AUX_C_N, DP_AUX_C_P, DP_P_N, DP_P_P, DP_TX0_C_N, DP_TX0_C_P, DP_TX0_N, DP_TX0_P

### Notes on the sheet
- (near R32) 1V24V
- UltraBase V2.1 5424
- DisplayPort
- www.CircuitValley.com <http://www.CircuitValley.com>

### Library data of the parts
C46 C47 C65 C66 = CAPC_100n_0402_16V_10%: as C25 on sheet PCIe; Tolerance: ±10%; Operating Temperature: -55°C ~ 125°C; Package / Case: 0402 (1005 Metric); Size / Dimension: 0.039" L x 0.020" W (1.00mm x 0.50mm); Supplier 1: Digi-Key; Supplier Part Number 1: 478-1126-1-ND; ComponentLink1URL: http://www.avx.com/docs/Catalogs/cx5r.pdf; ComponentLink1Description: http://www.avx.com/docs/Catalogs/cx5r.pdf; Supplier 2: Digi-Key; Supplier Part Number 2: 311-1347-1-ND; Manufacturer 2: Yageo; Manufacturer Part Number 2: CC0402KRX5R7BB104; ComponentLink2URL: http://www.yageo.com/documents/recent/UPY-GPHC_X5R_4V-to-50V_12.pdf; ComponentLink2Description: http://www.yageo.com/documents/recent/UPY-GPHC_X5R_4V-to-50V_12.pdf; Value: 100n
C63 C67-C69 C94 = CAPC_120p_0603_C0G_50V: as C22 on sheet PCIe; Tolerance: ±10%; Operating Temperature: -55°C ~ 125°C; Package / Case: 0603 (1608 Metric); Supplier 1: Mouser; Supplier Part Number 1: 80-C0603C121K5G
  C63 C94: Value: 1u
  C67-C69: Value: 100n
C64 = CAPC_1n_0603_100V: as C34 on sheet MIO_SD; Package / Case: 0603 (1608 metric); Tolerance: ±10%; Supplier 1: Digi-Key; Supplier Part Number 1: 490-4780-1-ND; Operating Temperature: -55°C ~ 125°C; Size / Dimension: 0.063" L x 0.031" W (1.60mm x 0.80mm); Thickness (Max): 0.035" (0.90mm); ComponentLink1URL: http://search.murata.co.jp/Ceramy/image/img/PDF/ENG/GCM188R72A102KA37.pdf; ComponentLink1Description: http://search.murata.co.jp/Ceramy/image/img/PDF/ENG/GCM188R72A102KA37.pdf; Value: 100n
C125 = CAPC_10u_1210_50V: as C5 on sheet PL_Conenctor; Package / Case: 1210 (3225 Metric); Tolerance: ±20%; Size / Dimension: 0.126" L x 0.098" W (3.20mm x 2.50mm); Supplier 1: Digi-Key; Supplier Part Number 1: 587-2225-1-ND; Value: 10µ
D1 = TPD8S009DSMR: Display Port ESD
D2 = TPD4E001DRLR: ESD Protection
D5 = Diode
J8 = G46M2023201AWEU: Mini Display Port
R12-R16 R31-R39 R85 R86 = RES_NL_0603: as R17 on sheet PCIe; Package / Case: 0603 (1608 metric)
U6 = FIN1019MTCX: Differential Buffer
U8 = AP7365-WG-7: LDO Reg ADJ 600mA

## Sheet Clock.SchDoc
size A3; SheetNumber: 8; SheetTotal: 13
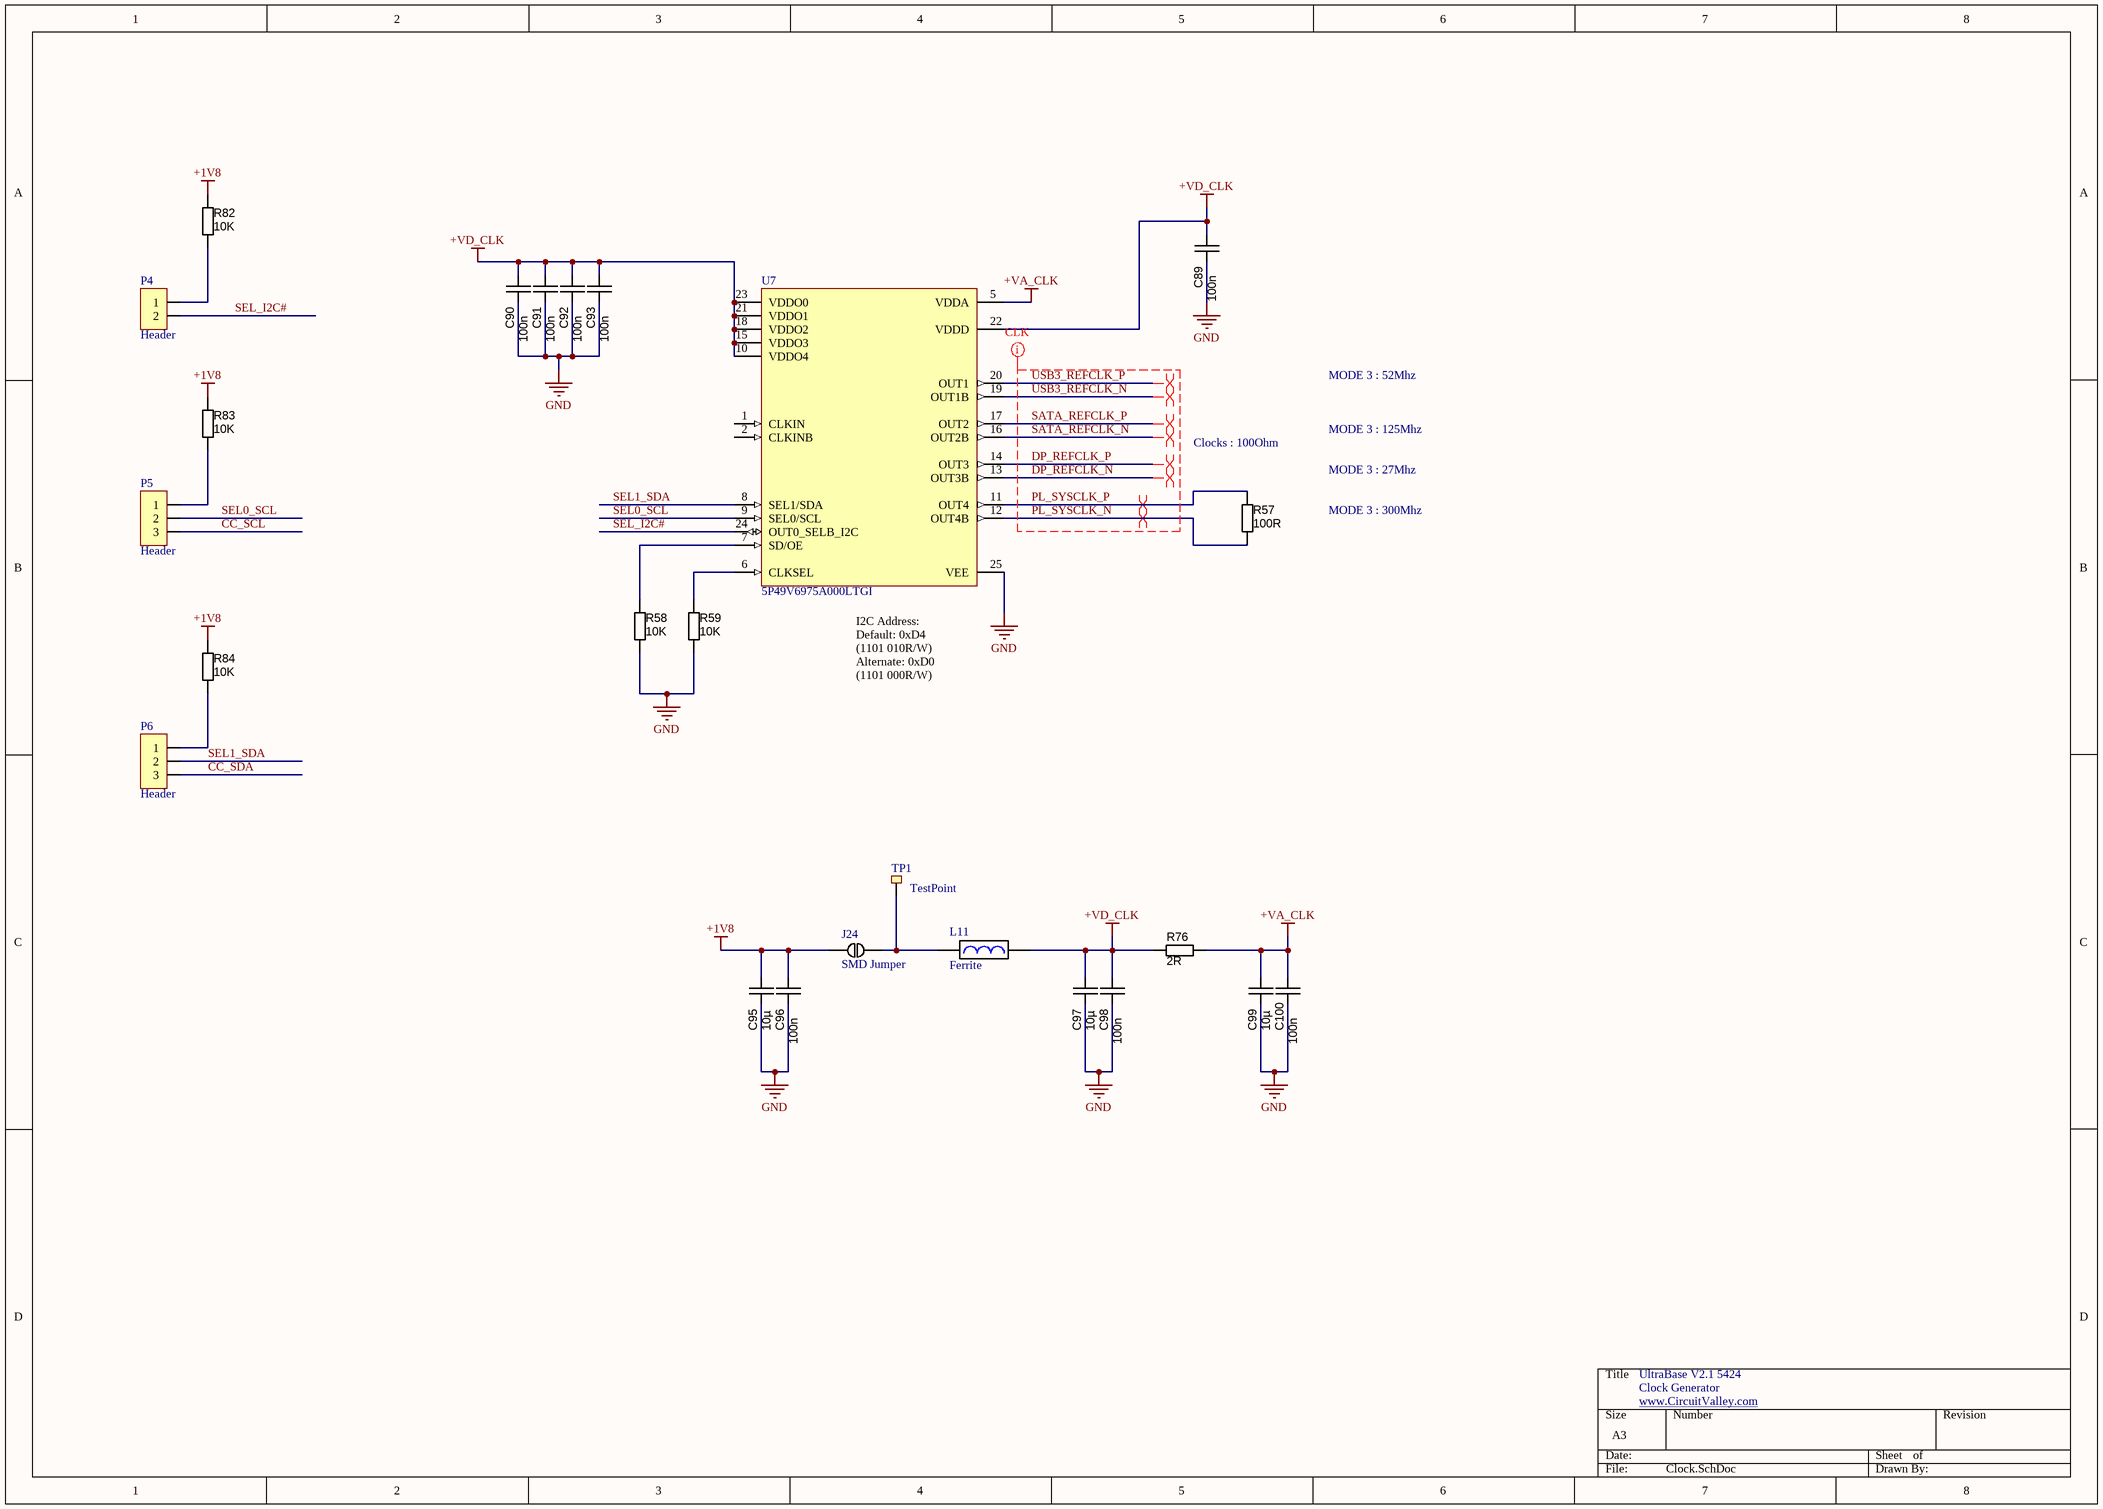
[diagram p7: Clock.SchDoc]

### Parts
C89  100n  [CAPC1608N]
C90  100n  [CAPC1608N]
C91  100n  [CAPC1608N]
C92  100n  [CAPC1608N]
C93  100n  [CAPC1608N]
C95  10µ  [CAPC3225N]
C96  100n  [CAPC1608N]
C97  10µ  [CAPC3225N]
C98  100n  [CAPC1608N]
C99  10µ  [CAPC3225N]
C100  100n  [CAPC1608N]
J24  SMD Jumper  [SMD_Jumper]  (net tie, no BOM)
L11  Ferrite  [FBC2012N]
P4  Header  [Header2x]
P5  Header  [Header3x]
P6  Header  [Header3x]
R57  value 100R  [RESC1608N]  (hidden comment: RES_NL_0603)
R58  value 10K  [RESC1608N]  (hidden comment: RES_NL_0603)
R59  value 10K  [RESC1608N]  (hidden comment: RES_NL_0603)
R76  value 2R  [RESC1608N]  (hidden comment: RES_NL_0603)
R82  value 10K  [RESC1608N]  (hidden comment: RES_NL_0603)
R83  value 10K  [RESC1608N]  (hidden comment: RES_NL_0603)
R84  value 10K  [RESC1608N]  (hidden comment: RES_NL_0603)
TP1  TestPoint  [SMD_test_point]
U7  5P49V6975A000LTGI  [LGA24]

### Nets
+1V8: C95.1 C96.1 J24.1 R82.2 R83.2 R84.2
+VA_CLK: C99.1 C100.1 R76.2 U7.5(VDDA)
+VD_CLK: C89.1 C90.1 C91.1 C92.1 C93.1 C97.1 C98.1 L11.2 R76.1 U7.10(VDDO4) U7.15(VDDO3) U7.18(VDDO2) U7.21(VDDO1) U7.22(VDDD) U7.23(VDDO0)
GND: C89.2 C90.2 C91.2 C92.2 C93.2 C95.2 C96.2 C97.2 C98.2 C99.2 C100.2 R58.1 R59.1 U7.25(VEE)
CC_SCL: P5.3
CC_SDA: P6.3
DP_REFCLK_N: U7.13(OUT3B)
DP_REFCLK_P: U7.14(OUT3)
PL_SYSCLK_N: R57.2 U7.12(OUT4B)
PL_SYSCLK_P: R57.1 U7.11(OUT4)
SATA_REFCLK_N: U7.16(OUT2B)
SATA_REFCLK_P: U7.17(OUT2)
SEL0_SCL: P5.2 U7.9(SEL0/SCL)
SEL1_SDA: P6.2 U7.8(SEL1/SDA)
SEL_I2C#: P4.2 U7.24(OUT0_SELB_I2C)
USB3_REFCLK_N: U7.19(OUT1B)
USB3_REFCLK_P: U7.20(OUT1)
NetJ24_2: J24.2 L11.1 TP1.1(TP)
NetP4_1: P4.1 R82.1
NetP5_1: P5.1 R83.1
NetP6_1: P6.1 R84.1
NetR58_2: R58.2 U7.7(SD/OE)
NetR59_2: R59.2 U7.6(CLKSEL)

Not connected (* = marked no-connect by the designer): U7 1(CLKIN) 2(CLKINB)

### Layout directives
differential pair: DP_REFCLK_N, DP_REFCLK_P, PL_SYSCLK_N, PL_SYSCLK_P, SATA_REFCLK_N, SATA_REFCLK_P, USB3_REFCLK_N, USB3_REFCLK_P
net class CLK: DP_REFCLK_N, DP_REFCLK_P, PL_SYSCLK_N, PL_SYSCLK_P, SATA_REFCLK_N, SATA_REFCLK_P, USB3_REFCLK_N, USB3_REFCLK_P

### Notes on the sheet
- MODE 3 : 52Mhz
- Clocks : 100Ohm
- MODE 3 : 125Mhz
- MODE 3 : 300Mhz
- MODE 3 : 27Mhz
- (near U7) I2C Address:
  Default: 0xD4
  (1101 010R/W)
  Alternate: 0xD0
  (1101 000R/W)
- UltraBase V2.1 5424
- Clock Generator
- www.CircuitValley.com <http://www.CircuitValley.com>

### Library data of the parts
C89-C93 C96 C98 C100 = CAPC_120p_0603_C0G_50V: as C22 on sheet PCIe; Tolerance: ±10%; Operating Temperature: -55°C ~ 125°C; Package / Case: 0603 (1608 Metric); Supplier 1: Mouser; Supplier Part Number 1: 80-C0603C121K5G; Value: 100n
C95 C97 C99 = CAPC_10u_1210_50V: as C5 on sheet PL_Conenctor; Package / Case: 1210 (3225 Metric); Tolerance: ±20%; Size / Dimension: 0.126" L x 0.098" W (3.20mm x 2.50mm); Supplier 1: Digi-Key; Supplier Part Number 1: 587-2225-1-ND; Value: 10µ
J24 = SMD_Jumper
L11 = Ferrite Bead
P4 = Header_2Pin: 2 Pin Header
P5 P6 = Header_3Pin: 3 Pin Header
R57-R59 R76 R82-R84 = RES_NL_0603: as R17 on sheet PCIe; Package / Case: 0603 (1608 metric)
TP1 = SMD_Test_Point: SMD Test Point
U7 = 5P49V6975: Programmable Clock Generators